# Altium project Control de Carga IoT.PrjPcb
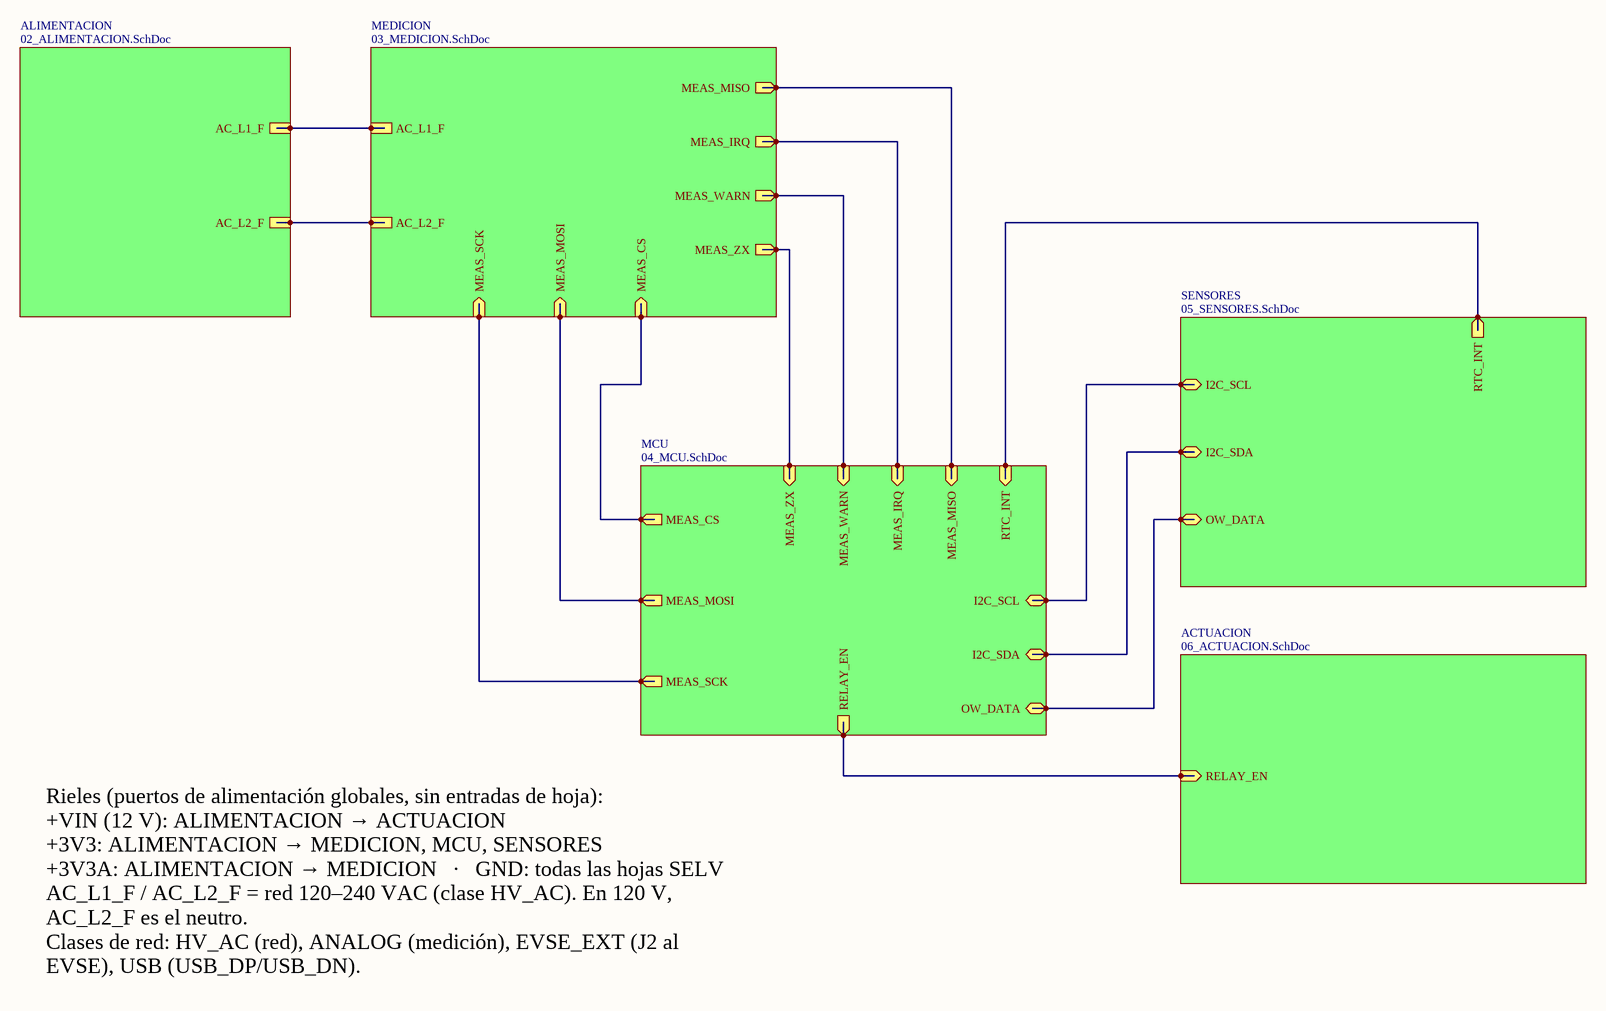
[diagram p0: 01_TOP.SchDoc]
DrawnBy: Nicolás Gómez Ramírez; ProjectName: Control de carga EVSE; Revision: 1.0
6 sheets, 132 parts. Net scope: hierarchical (ports join the sheet entries above them; power ports are global).
Board file: EVSE_Monitor.PcbDoc
Sheets:
  01_TOP.SchDoc
    ALIMENTACION = 02_ALIMENTACION.SchDoc
    MEDICION = 03_MEDICION.SchDoc
    MCU = 04_MCU.SchDoc
    SENSORES = 05_SENSORES.SchDoc
    ACTUACION = 06_ACTUACION.SchDoc

## Sheet 01_TOP.SchDoc: Diagrama de bloques (hoja TOP)
size 420 x 297 mm; Address1: Hardware en IoT · 2026; SheetNumber: 1; SheetTotal: 6

### Sub-sheets
ACTUACION = 06_ACTUACION.SchDoc: RELAY_EN (in)
ALIMENTACION = 02_ALIMENTACION.SchDoc: AC_L1_F, AC_L2_F
MCU = 04_MCU.SchDoc: MEAS_MISO (in), MEAS_IRQ (in), I2C_SDA (bidir), I2C_SCL (bidir), MEAS_SCK (out), MEAS_MOSI (out), MEAS_CS (out), RELAY_EN (out), MEAS_WARN (in), MEAS_ZX (in), RTC_INT (in), OW_DATA (bidir)
MEDICION = 03_MEDICION.SchDoc: AC_L1_F, AC_L2_F, MEAS_IRQ (out), MEAS_WARN (out), MEAS_MISO (out), MEAS_ZX (out), MEAS_SCK (in), MEAS_MOSI (in), MEAS_CS (in)
SENSORES = 05_SENSORES.SchDoc: I2C_SCL (bidir), I2C_SDA (bidir), OW_DATA (bidir), RTC_INT (out)

### Nets
AC_L1_F: sheet ALIMENTACION/AC_L1_F, sheet MEDICION/AC_L1_F
AC_L2_F: sheet ALIMENTACION/AC_L2_F, sheet MEDICION/AC_L2_F
I2C_SCL: sheet MCU/I2C_SCL, sheet SENSORES/I2C_SCL
I2C_SDA: sheet MCU/I2C_SDA, sheet SENSORES/I2C_SDA
MEAS_CS: sheet MEDICION/MEAS_CS, sheet MCU/MEAS_CS
MEAS_IRQ: sheet MEDICION/MEAS_IRQ, sheet MCU/MEAS_IRQ
MEAS_MISO: sheet MEDICION/MEAS_MISO, sheet MCU/MEAS_MISO
MEAS_MOSI: sheet MEDICION/MEAS_MOSI, sheet MCU/MEAS_MOSI
MEAS_SCK: sheet MEDICION/MEAS_SCK, sheet MCU/MEAS_SCK
MEAS_WARN: sheet MEDICION/MEAS_WARN, sheet MCU/MEAS_WARN
MEAS_ZX: sheet MEDICION/MEAS_ZX, sheet MCU/MEAS_ZX
OW_DATA: sheet MCU/OW_DATA, sheet SENSORES/OW_DATA
RELAY_EN: sheet MCU/RELAY_EN, sheet ACTUACION/RELAY_EN
RTC_INT: sheet MCU/RTC_INT, sheet SENSORES/RTC_INT

### Notes on the sheet
- Rieles (puertos de alimentación globales, sin entradas de hoja):
  +VIN (12 V): ALIMENTACION → ACTUACION
  +3V3: ALIMENTACION → MEDICION, MCU, SENSORES
  +3V3A: ALIMENTACION → MEDICION   ·   GND: todas las hojas SELV
  AC_L1_F / AC_L2_F = red 120–240 VAC (clase HV_AC). En 120 V, AC_L2_F es el neutro.
  Clases de red: HV_AC (red), ANALOG (medición), EVSE_EXT (J2 al EVSE), USB (USB_DP/USB_DN).
- CONTROL DE CARGA EVSE · HARDWARE EN IOT 2026
- DISEÑO: NICOLÁS GÓMEZ RAMÍREZ
- DWG NO:
- REVISION
- REV:
- DESCRIPTION
- DATE
- APPROVED
- ZONA DE RED 120–240 VAC CON AISLAMIENTO REFORZADO
- USO ACADÉMICO, SIN GARANTÍA.
- ENG:
- APPROVALS
- PROJECT
- DSN:
- CHK:
- REFERENCE DOCUMENTS
- PROJECT REVISION:
- TITLE
- DOCUMENT REVISION:
- DESIGN BY:
- BOM:
- FAB DWG:
- PCB DWG:
- ASSY DWG:
- SCALE:
- A3
- SIZE
- CAGE CODE
- FILE NAME
- DWG NO.
- SHEET
- OF
- REV

## Sheet 02_ALIMENTACION.SchDoc: Alimentación: red, 12 V y 3,3 V
size 420 x 297 mm; Address1: Hardware en IoT · 2026; SheetNumber: 2; SheetTotal: 6
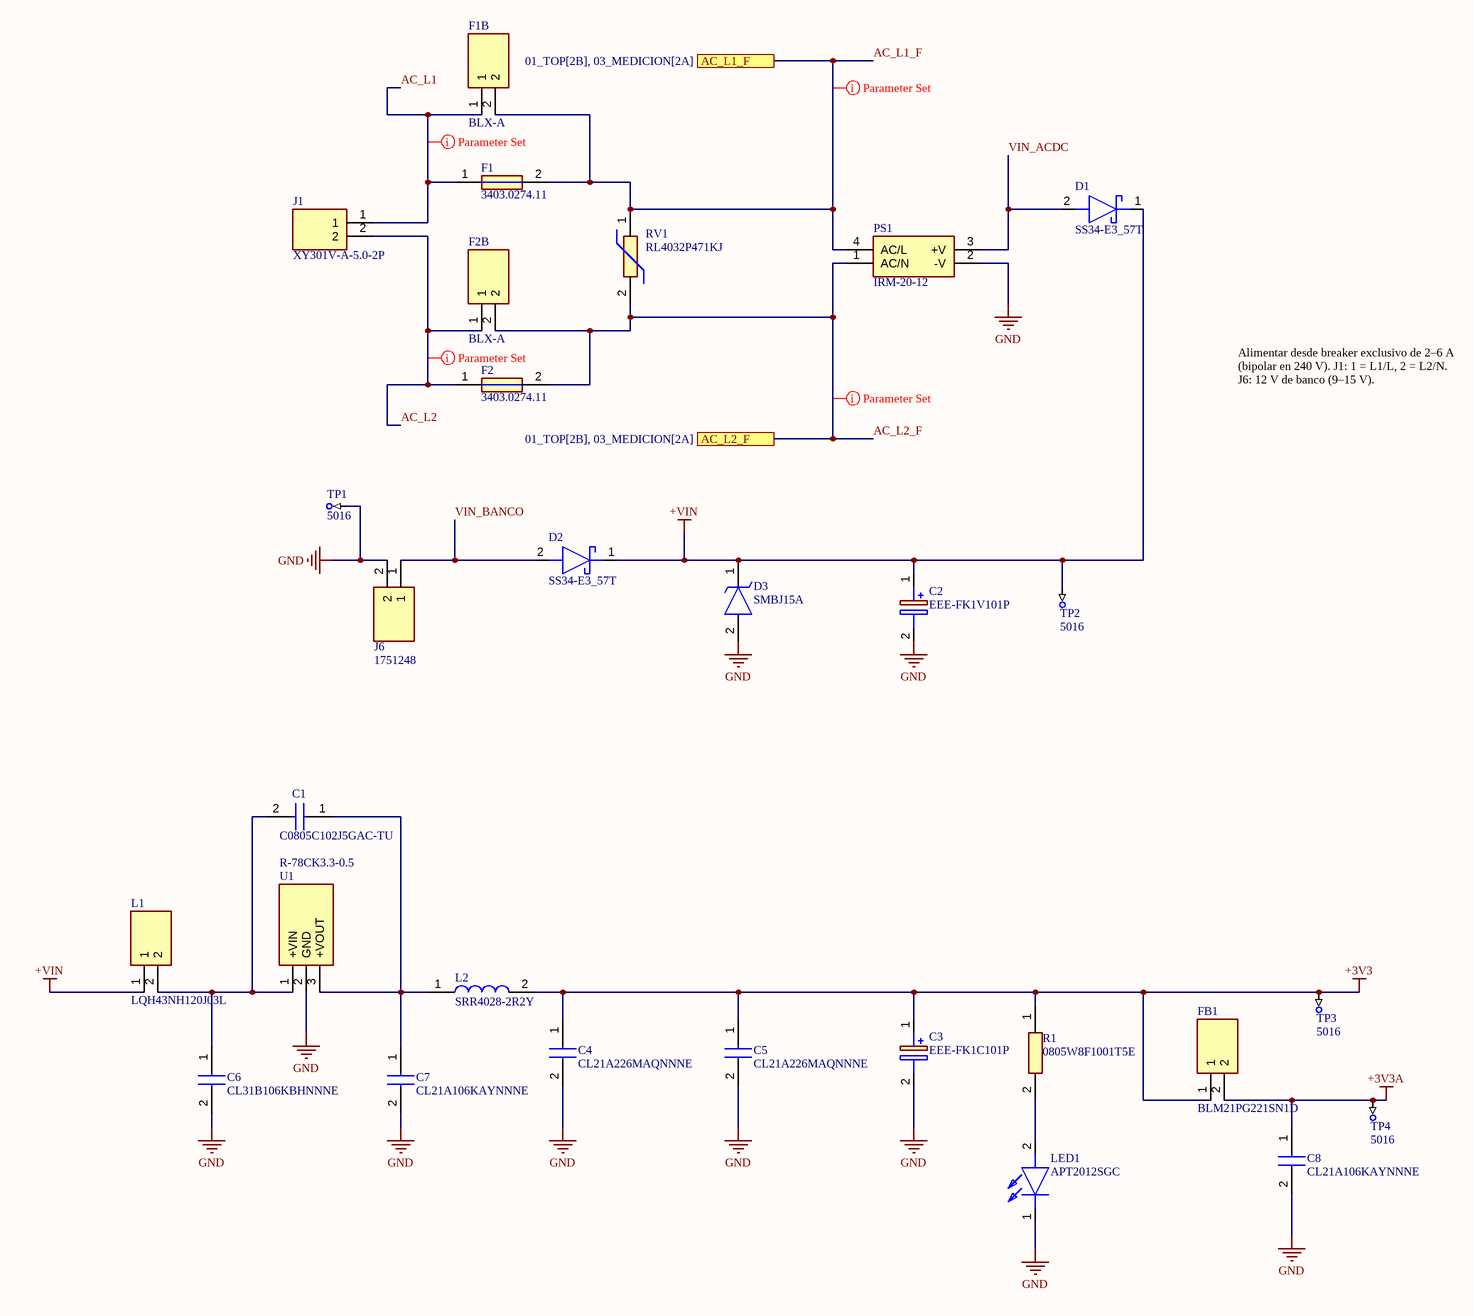
[diagram p1: 02_ALIMENTACION.SchDoc]

### Parts
C1  C0805C102J5GAC-TU  [CAPC2012X88N]
C2  EEE-FK1V101P  [EEHZT1E331UP]
C3  EEE-FK1C101P  [EEE1AA101SP]
C4  CL21A226MAQNNNE  [CAPC2012X140N]
C5  CL21A226MAQNNNE  [CAPC2012X140N]
C6  CL31B106KBHNNNE  [CAPC3216X180N]
C7  CL21A106KAYNNNE  [CAPC2012X145N]
C8  CL21A106KAYNNNE  [CAPC2012X145N]
D1  SS34-E3_57T  [DIOM7959X262N]
D2  SS34-E3_57T  [DIOM7959X262N]
D3  SMBJ15A  [DIOM5436X244N]
F1  3403.0274.11  [3403027423]
F1B  BLX-A  [BLX-A_5X20]
F2  3403.0274.11  [3403027423]
F2B  BLX-A  [BLX-A_5X20]
FB1  BLM21PG221SN1D  [BEADC2012X105N]
J1  XY301V-A-5.0-2P  [TB001-500-02BE]
J6  1751248  [1751248]
L1  LQH43NH120J03L  [RLS126]
L2  SRR4028-2R2Y  [SRR4028]
LED1  APT2012SGC  [LEDC2012X85N]
PS1  IRM-20-12  [IRM2012]
R1  0805W8F1001T5E  [RESC2012X60N]
RV1  RL4032P471KJ  [CU4032]
TP1  5016  [KEYSTONE-5016_V]
TP2  5016  [KEYSTONE-5016_V]
TP3  5016  [KEYSTONE-5016_V]
TP4  5016  [KEYSTONE-5016_V]
U1  R-78CK3.3-0.5  [R78CK3305]

### Ports
AC_L1_F (see 01_TOP[2B], 03_MEDICION[2A]), AC_L2_F (see 01_TOP[2B], 03_MEDICION[2A])

### Nets
+3V3: C3.1(+) C4.1 C5.1 FB1.1 L2.2 R1.1 TP3.1
+3V3A: C8.1 FB1.2 TP4.1
+VIN: C2.1(+) D1.1(K) D2.1(K) D3.1(K) L1.1 TP2.1
GND: C2.2(-) C3.2(-) C4.2 C5.2 C6.2 C7.2 C8.2 D3.2(A) J6.2 LED1.1(K) PS1.2(-V) TP1.1 U1.2(GND)
AC_L1: F1.1 F1B.1 J1.1
AC_L1_F: F1.2 F1B.2 PS1.4(AC/L) RV1.1 ; port AC_L1_F
AC_L2: F2.1 F2B.1 J1.2
AC_L2_F: F2.2 F2B.2 PS1.1(AC/N) RV1.2 ; port AC_L2_F
VIN_ACDC: D1.2(A) PS1.3(+V)
VIN_BANCO: D2.2(A) J6.1
NetC1_1: C1.1 C7.1 L2.1 U1.3(+VOUT)
NetC1_2: C1.2 C6.1 L1.2 U1.1(+VIN)
NetLED1_2: LED1.2(A) R1.2

### Layout directives
net class HV_AC: AC_L1, AC_L1_F, AC_L2, AC_L2_F

### Notes on the sheet
- Alimentar desde breaker exclusivo de 2–6 A (bipolar en 240 V). J1: 1 = L1/L, 2 = L2/N. J6: 12 V de banco (9–15 V).
- CONTROL DE CARGA EVSE · HARDWARE EN IOT 2026
- DISEÑO: NICOLÁS GÓMEZ RAMÍREZ
- DWG NO:
- REVISION
- REV:
- DESCRIPTION
- DATE
- APPROVED
- ZONA DE RED 120–240 VAC CON AISLAMIENTO REFORZADO
- USO ACADÉMICO, SIN GARANTÍA.
- ENG:
- APPROVALS
- PROJECT
- DSN:
- CHK:
- REFERENCE DOCUMENTS
- PROJECT REVISION:
- TITLE
- DOCUMENT REVISION:
- DESIGN BY:
- BOM:
- FAB DWG:
- PCB DWG:
- ASSY DWG:
- SCALE:
- A3
- SIZE
- CAGE CODE
- FILE NAME
- DWG NO.
- SHEET
- OF
- REV

### Library data of the parts
C1 = C0805C102J5GAC-TU: Capacitor; Manufacturer_Name: KEMET; Manufacturer_Part_Number: C0805C102J5GACTU; Assembly: JLCPCB; Value: 1nF 50V C0G; Datasheet Link: https://www.kemet.com/specsheet/C0805C102J5GACTU; Height: 0.88mm; Supplier: JLCPCB; Supplier PN: LCSC C2167084
C2 = EEE-FK1V101P: Capacitor Polarised; Manufacturer_Name: Panasonic; Assembly: JLCPCB; Value: 100uF 35V; Datasheet Link: http://industrial.panasonic.com/cdbs/www-data/pdf/RDE0000/ABA0000C1181.pdf; Height: 10.8mm; Manufacturer_Part_Number: EEE-FK1V101P; Supplier: JLCPCB; Supplier PN: LCSC C128462
C3 = EEE-FK1C101P: Capacitor Polarised; Manufacturer_Name: Panasonic; Assembly: JLCPCB; Value: 100uF 16V; Datasheet Link: http://industrial.panasonic.com/cdbs/www-data/pdf/RDE0000/ABA0000C1181.pdf; Height: 7.8mm; Manufacturer_Part_Number: EEE-FK1C101P; Supplier: JLCPCB; Supplier PN: LCSC C128532
C4 C5 = CL21A226MAQNNNE: Capacitor; Manufacturer_Name: Samsung Electro-Mechanics; Assembly: JLCPCB; Value: 22uF 25V; Datasheet Link: https://datasheet.datasheetarchive.com/originals/distributors/Datasheets-DGA10/2406310.pdf; Height: 1.4mm; Manufacturer_Part_Number: CL21A226MAQNNNE; Supplier: JLCPCB; Supplier PN: LCSC C45783
C6 = CL31B106KBHNNNE: Capacitor; Manufacturer_Name: Samsung Electro-Mechanics; Assembly: JLCPCB; Value: 10uF 50V; Datasheet Link: https://datasheet.datasheetarchive.com/originals/distributors/DKDS-19/375194.pdf; Height: 1.8mm; Manufacturer_Part_Number: CL31B106KBHNNNE; Supplier: JLCPCB; Supplier PN: LCSC C89632
C7 C8 = CL21A106KAYNNNE: Capacitor; Manufacturer_Name: Samsung Electro-Mechanics; Assembly: JLCPCB; Value: 10uF 25V; Datasheet Link: https://datasheet.datasheetarchive.com/originals/distributors/Datasheets_SAMA/6a45835c9b7400e9b49c55c38a8ff4a2.pdf; Height: 1.45mm; Manufacturer_Part_Number: CL21A106KAYNNNE; Supplier: JLCPCB; Supplier PN: LCSC C15850
D1 D2 = SS34-E3_57T: Schottky Diode; Manufacturer_Name: Vishay; Manufacturer_Part_Number: SS34-E3/57T; Assembly: JLCPCB; Value: 40V 3A; Datasheet Link: https://www.vishay.com/docs/88751/ss32.pdf; Height: 2.62mm; Supplier: JLCPCB; Supplier PN: LCSC C13354
D3 = SMBJ15A: TVS Diode (Uni-directional); Manufacturer_Name: Littelfuse; Assembly: JLCPCB; Value: 15V 600W; Datasheet Link: http://www.vishay.com/docs/88392/smbj.pdf; Height: 2.44mm; Manufacturer_Part_Number: SMBJ15A; Supplier: JLCPCB; Supplier PN: LCSC C83846
F1 F2 = 3403.0274.11: Fusible SMD UMT-H T1A 277 VAC, ruptura 1500 A (bolsa); Manufacturer_Name: Schurter; Assembly: JLCPCB; Manufacturer_Part_Number: 3403.0274.11; Supplier: JLCPCB; Supplier PN: LCSC C6384960; Value: T1A 277VAC
F1B F2B = BLX-A: Portafusible 5x20 mm para PCB, 2 pines a 22 mm (XC Electronics BLX-A, LCSC C3131); Assembly: DNP; Value: 5x20 6.3A 250V; Manufacturer_Name: XC Electronics; Manufacturer_Part_Number: BLX-A; Supplier: Sigma; Supplier PN: BLX-A
FB1 = BLM21PG221SN1D: Ferrite Bead; Manufacturer_Name: Murata; Assembly: JLCPCB; Value: 220R@100MHz; Datasheet Link: https://datasheet.datasheetarchive.com/originals/dk/DKDS-31/605570.pdf; Height: 1.05mm; Manufacturer_Part_Number: BLM21PG221SN1D; Supplier: JLCPCB; Supplier PN: LCSC C85840
J1 = XY301V-A-5.0-2P: Bornera de tornillo 2 polos, paso 5.0 mm, 300 V 15 A, 22-14 AWG; Manufacturer_Name: Xinlaiya; Assembly: JLCPCB; Value: 2P 5.0mm 300V; Manufacturer_Part_Number: XY301V-A-5.0-2P; Supplier: JLCPCB; Supplier PN: LCSC C557651
J6 = 1751248: Connector; Manufacturer_Name: Phoenix Contact; Assembly: JLCPCB; Value: 2P 3.5mm; Datasheet Link: https://www.phoenixcontact.com/en-us/products/printed-circuit-board-terminal-mkds-1-2-35-1751248?type=pdf; Height: 8.65mm; Manufacturer_Part_Number: 1751248; Supplier: JLCPCB; Supplier PN: LCSC C89122
L1 = LQH43NH120J03L: Inductor 12 uH 5% 420 mA 0.25 ohm 1812, AEC-Q200; Manufacturer_Name: Murata; Assembly: JLCPCB; Value: 12uH; Manufacturer_Part_Number: LQH43NH120J03L; Supplier: JLCPCB; Supplier PN: LCSC C3224514
L2 = SRR4028-2R2Y: Inductor; Manufacturer_Name: Bourns; Assembly: JLCPCB; Value: 2.2uH; Datasheet Link: https://www.bourns.com/pdfs/SRR4028.pdf; Manufacturer_Part_Number: SRR4028-2R2Y; Supplier: JLCPCB; Supplier PN: LCSC C2041777
LED1 = APT2012SGC: LED; Manufacturer_Name: Kingbright; Assembly: JLCPCB; Value: verde; Datasheet Link: http://www.us.kingbright.com/images/catalog/SPEC/APT2012SGC.pdf; Height: 0.85mm; Manufacturer_Part_Number: APT2012SGC; Supplier: JLCPCB; Supplier PN: LCSC C5353439
PS1 = IRM-20-12: Power Supply; Manufacturer_Name: Mean Well; Assembly: JLCPCB; Value: 12V 1.8A; Datasheet Link: https://www.meanwell.com/Upload/PDF/IRM-20/IRM-20-SPEC.PDF; Height: 24mm; Manufacturer_Part_Number: IRM-20-12; Supplier: JLCPCB; Supplier PN: LCSC C5278499
R1 = 0805W8F1001T5E: Resistor 1 kOhm 1% 125 mW 0805; Manufacturer_Name: UNI-ROYAL; Assembly: JLCPCB; Value: 1k; Manufacturer_Part_Number: 0805W8F1001T5E; Supplier: JLCPCB; Supplier PN: LCSC C17513
RV1 = RL4032P471KJ: Varistor SMD 300 VAC, 470 V, 2500 A (8/20 us), 30 J, 4032; Manufacturer_Name: Ruilon; Assembly: JLCPCB; Value: 300VAC; Manufacturer_Part_Number: RL4032P471KJ; Supplier: JLCPCB; Supplier PN: LCSC C2935514
TP1-TP4 = CMP-2000-05178-1: Test Point, 1-Pin SMT, RoHS, Tape and Reel; Manufacturer: Keystone; Manufacturer_Name: ronghe; Manufacturer_Part_Number: RH-5016; Other Names: 5016KDKR; Featured Product: SurfaceMountTestPoints / 5019MiniatureSurfaceMountTestPoint; Online Catalog: SurfaceMountTestPoints; Catalog Drawings: 5016Top / 5016Side / 5016Front; Value: TP; Assembly: JLCPCB; Packaging: Digi-Reel; RoHS Information: RoHSComplianceStatement; Package Reference: 5016; Mounting Type: SurfaceMount; Type: PCTestPoint,Compact; Manufacturer URL: http://www.keyelco.com/; Standard Package: 1; Package Description: 1-Pin Test Point, Body 3.81 x 2.04 mm; Category: TestandMeasurement; Terminal: 0.015"(0.38mm)PhosphorBronze,SilverPlated; Datasheet URL: https://ciiva.com/datasheet-click-2917613?src=ciiva&sig=4a4e90f; Datasheet Version: Rev. D, 03/2014; Family: TestPoints; Material: PhosphorBronze; Supplier: JLCPCB; Supplier PN: LCSC C5199799
U1 = R-78CK3.3-0.5: Regulador conmutado 3.3 V 0.5 A, SIP3; Manufacturer_Name: RECOM Power; Assembly: Manual; Datasheet Link: https://recom-power.com/pdf/Innoline/R-78CK-0.5.pdf; Height: 10.7mm; Manufacturer_Part_Number: R-78CK3.3-0.5; Supplier: Disponible; Supplier PN: -; Value: 3.3V 0.5A

## Sheet 03_MEDICION.SchDoc: Medición de tensión y corriente
size 420 x 297 mm; Address1: Hardware en IoT · 2026; SheetNumber: 3; SheetTotal: 6
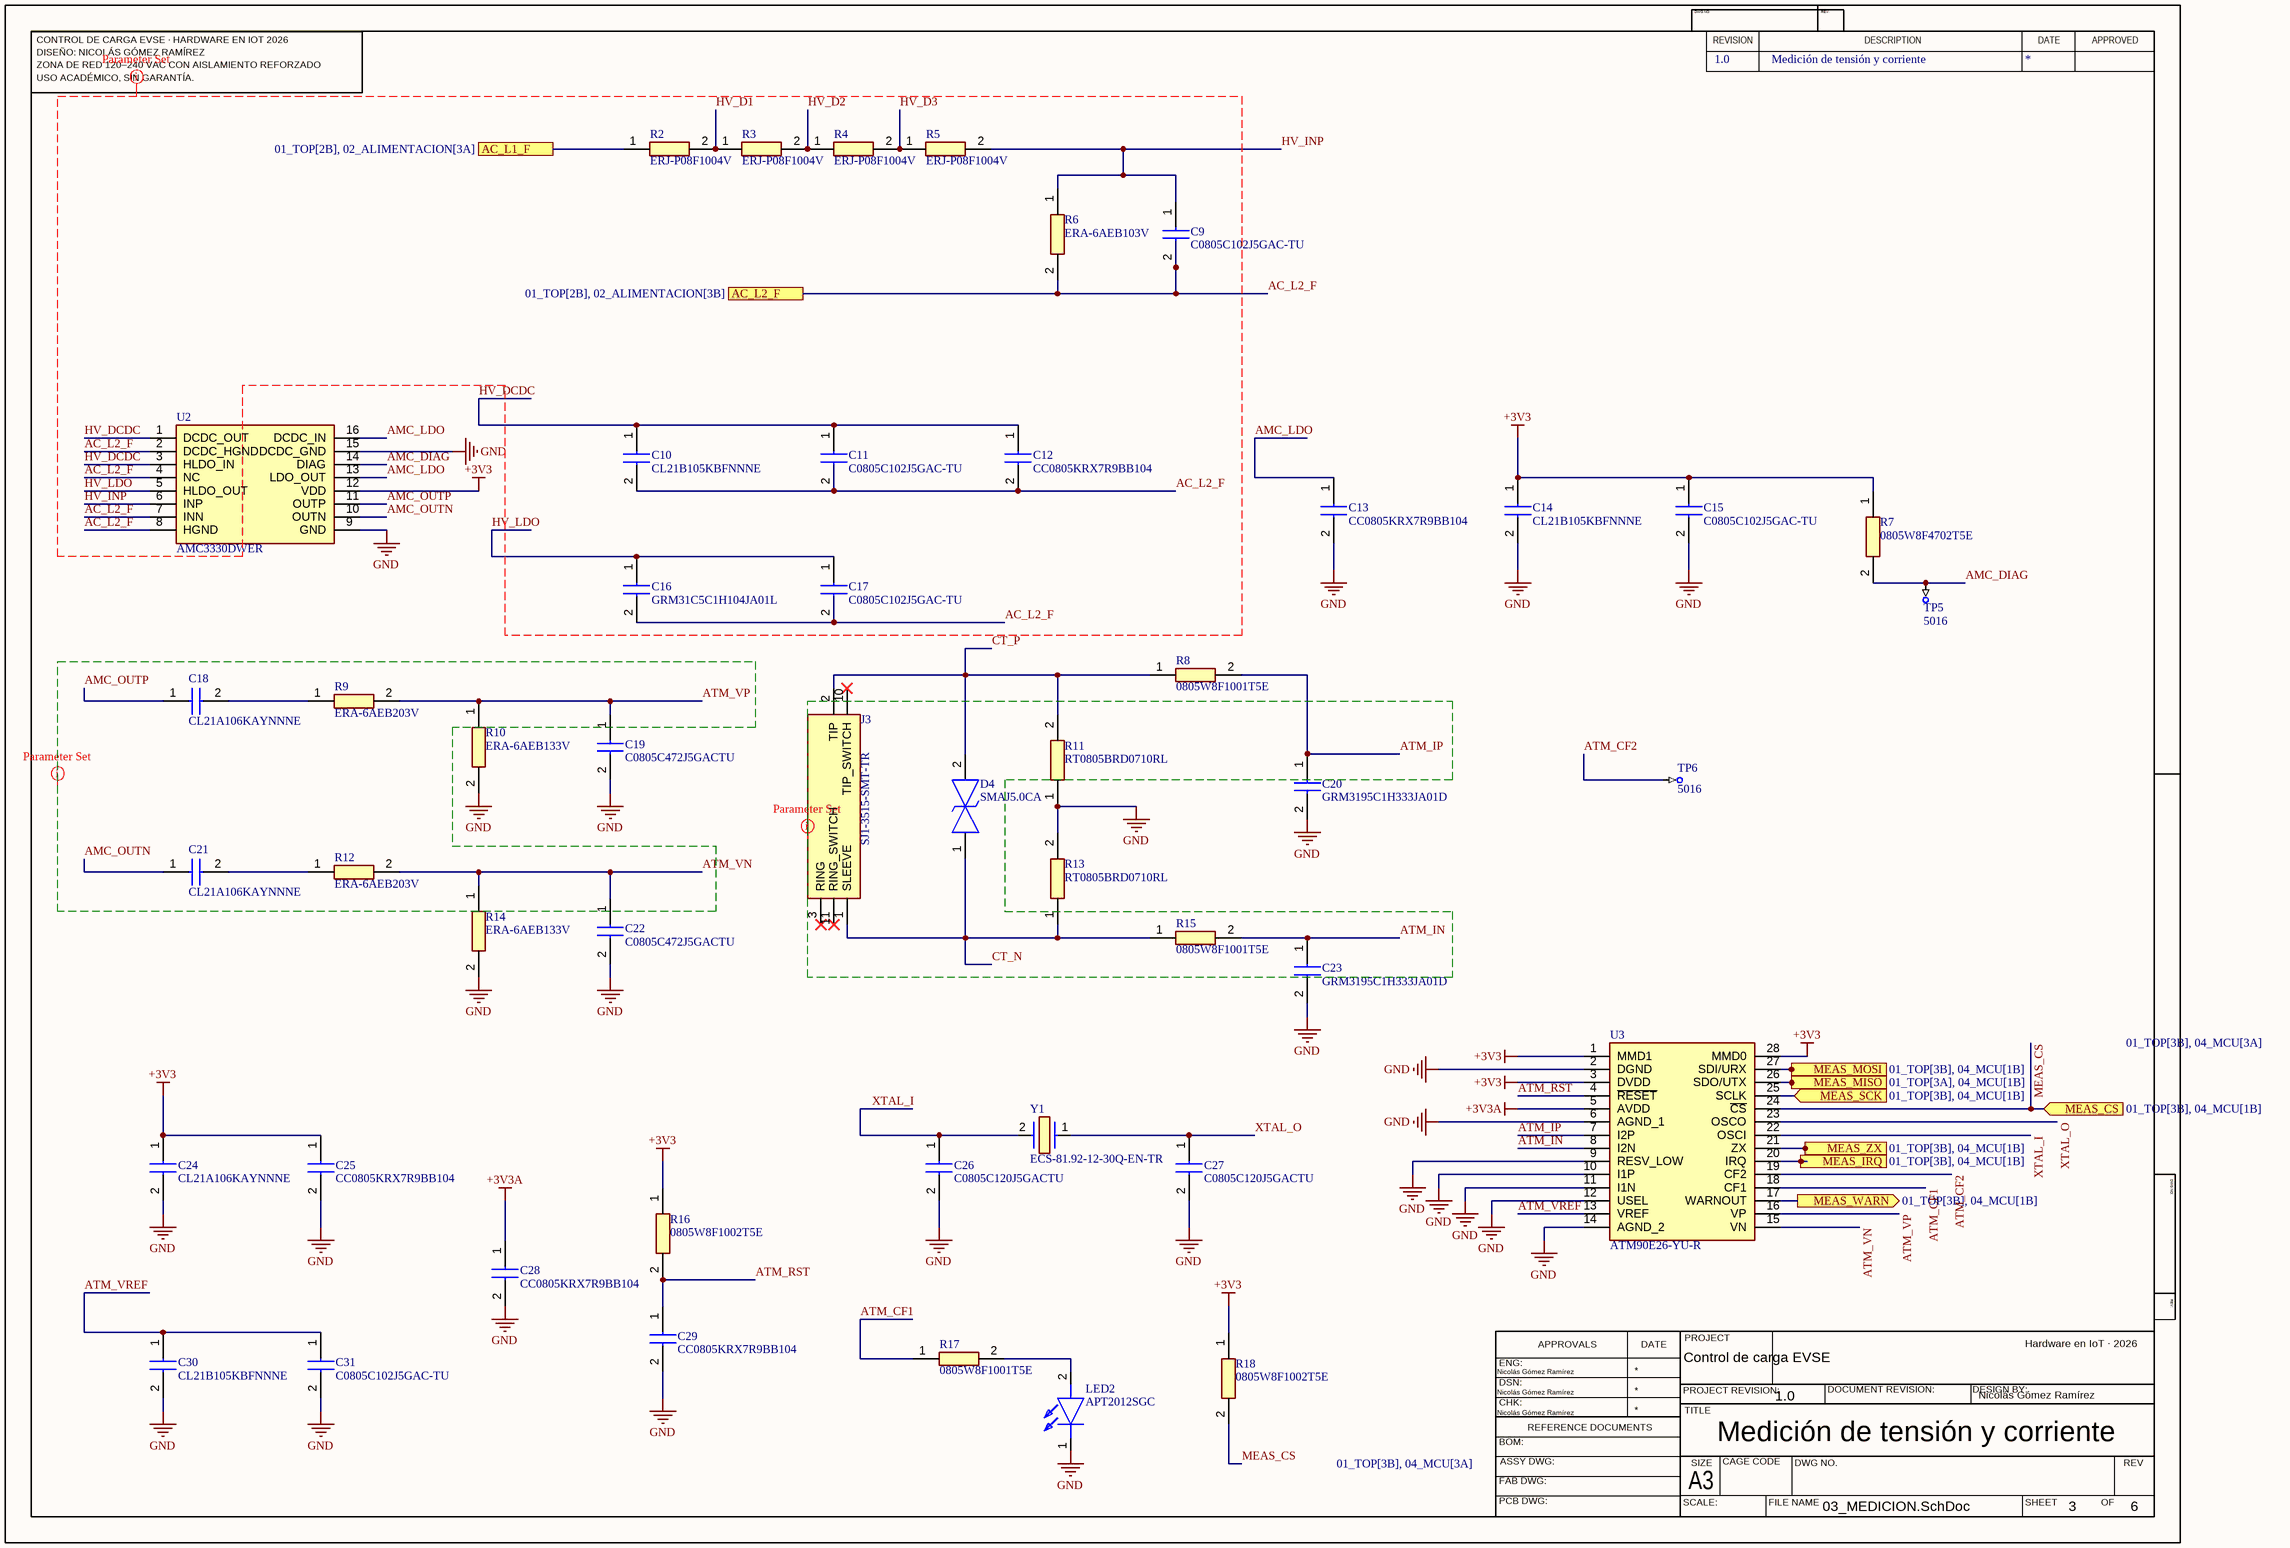
[diagram p2: 03_MEDICION.SchDoc]

### Parts
C9  C0805C102J5GAC-TU  [CAPC2012X88N]
C10  CL21B105KBFNNNE  [CAPC2012X88N]
C11  C0805C102J5GAC-TU  [CAPC2012X88N]
C12  CC0805KRX7R9BB104  [CAPC2012X88N]
C13  CC0805KRX7R9BB104  [CAPC2012X88N]
C14  CL21B105KBFNNNE  [CAPC2012X88N]
C15  C0805C102J5GAC-TU  [CAPC2012X88N]
C16  GRM31C5C1H104JA01L  [CAPC3216X180N]
C17  C0805C102J5GAC-TU  [CAPC2012X88N]
C18  CL21A106KAYNNNE  [CAPC2012X145N]
C19  C0805C472J5GACTU  [CAPC2012X88N]
C20  GRM3195C1H333JA01D  [CAPC3216X180N]
C21  CL21A106KAYNNNE  [CAPC2012X145N]
C22  C0805C472J5GACTU  [CAPC2012X88N]
C23  GRM3195C1H333JA01D  [CAPC3216X180N]
C24  CL21A106KAYNNNE  [CAPC2012X145N]
C25  CC0805KRX7R9BB104  [CAPC2012X88N]
C26  C0805C120J5GACTU  [CAPC2012X88N]
C27  C0805C120J5GACTU  [CAPC2012X88N]
C28  CC0805KRX7R9BB104  [CAPC2012X88N]
C29  CC0805KRX7R9BB104  [CAPC2012X88N]
C30  CL21B105KBFNNNE  [CAPC2012X88N]
C31  C0805C102J5GAC-TU  [CAPC2012X88N]
D4  SMAJ5.0CA  [DIONM5026X229N]
J3  SJ1-3515-SMT-TR  [SJ13515SMTTR]
LED2  APT2012SGC  [LEDC2012X85N]
R2  ERJ-P08F1004V  [ERJP08_(1206)]
R3  ERJ-P08F1004V  [ERJP08_(1206)]
R4  ERJ-P08F1004V  [ERJP08_(1206)]
R5  ERJ-P08F1004V  [ERJP08_(1206)]
R6  ERA-6AEB103V  [RESC2012X60N]
R7  0805W8F4702T5E  [RESC2012X60N]
R8  0805W8F1001T5E  [RESC2012X60N]
R9  ERA-6AEB203V  [RESC2012X60N]
R10  ERA-6AEB133V  [RESC2012X60N]
R11  RT0805BRD0710RL  [RESC2012X60N]
R12  ERA-6AEB203V  [RESC2012X60N]
R13  RT0805BRD0710RL  [RESC2012X60N]
R14  ERA-6AEB133V  [RESC2012X60N]
R15  0805W8F1001T5E  [RESC2012X60N]
R16  0805W8F1002T5E  [RESC2012X60N]
R17  0805W8F1001T5E  [RESC2012X60N]
R18  0805W8F1002T5E  [RESC2012X60N]
TP5  5016  [KEYSTONE-5016_V]
TP6  5016  [KEYSTONE-5016_V]
U2  AMC3330DWER  [SOIC127P1030X265-16N]
U3  ATM90E26-YU-R  [SOP65P778X199-28N]
Y1  ECS-81.92-12-30Q-EN-TR  [ECS81921230QENTR]

### Ports
AC_L1_F (see 01_TOP[2B], 02_ALIMENTACION[3A]), AC_L2_F (see 01_TOP[2B], 02_ALIMENTACION[3B]), MEAS_CS (in, see 01_TOP[3B], 04_MCU[1B]), MEAS_IRQ (out, see 01_TOP[3B], 04_MCU[1B]), MEAS_MISO (out, see 01_TOP[3A], 04_MCU[1B]), MEAS_MOSI (in, see 01_TOP[3B], 04_MCU[1B]), MEAS_SCK (in, see 01_TOP[3B], 04_MCU[1B]), MEAS_WARN (out, see 01_TOP[3B], 04_MCU[1B]), MEAS_ZX (out, see 01_TOP[3B], 04_MCU[1B])

### Nets
+3V3: C14.1 C15.1 C24.1 C25.1 R7.1 R16.1 R18.1 U2.12(VDD) U3.1(MMD1) U3.3(DVDD) U3.28(MMD0)
+3V3A: C28.1 U3.5(AVDD)
GND: C13.2 C14.2 C15.2 C19.2 C20.2 C22.2 C23.2 C24.2 C25.2 C26.2 C27.2 C28.2 C29.2 C30.2 C31.2 LED2.1(K) R10.2 R11.1 R13.2 R14.2 U2.9(GND) U2.15(DCDC_GND) U3.2(DGND) U3.6(AGND_1) U3.9(RESV_LOW) U3.10(I1P) U3.11(I1N) U3.12(USEL) U3.14(AGND_2)
AC_L1_F: R2.1 ; port AC_L1_F
AC_L2_F: C9.2 C10.2 C11.2 C12.2 C16.2 C17.2 R6.2 U2.2(DCDC_HGND) U2.4(NC) U2.7(INN) U2.8(HGND) ; port AC_L2_F
AMC_DIAG: R7.2 TP5.1 U2.14(DIAG)
AMC_LDO: C13.1 U2.13(LDO_OUT) U2.16(DCDC_IN)
AMC_OUTN: C21.1 U2.10(OUTN)
AMC_OUTP: C18.1 U2.11(OUTP)
ATM_CF1: R17.1 U3.18(CF1)
ATM_CF2: TP6.1 U3.19(CF2)
ATM_IN: C23.1 R15.2 U3.8(I2N)
ATM_IP: C20.1 R8.2 U3.7(I2P)
ATM_RST: C29.1 R16.2 U3.4(~{RESET})
ATM_VN: C22.1 R12.2 R14.1 U3.15(VN)
ATM_VP: C19.1 R9.2 R10.1 U3.16(VP)
ATM_VREF: C30.1 C31.1 U3.13(VREF)
CT_N: D4.1 J3.1(SLEEVE) R13.1 R15.1
CT_P: D4.2 J3.2(TIP) R8.1 R11.2
HV_D1: R2.2 R3.1
HV_D2: R3.2 R4.1
HV_D3: R4.2 R5.1
HV_DCDC: C10.1 C11.1 C12.1 U2.1(DCDC_OUT) U2.3(HLDO_IN)
HV_INP: C9.1 R5.2 R6.1 U2.6(INP)
HV_LDO: C16.1 C17.1 U2.5(HLDO_OUT)
MEAS_CS: R18.2 U3.24(~{CS}) ; port MEAS_CS
MEAS_IRQ: U3.20(IRQ) ; port MEAS_IRQ
MEAS_MISO: U3.26(SDO/UTX) ; port MEAS_MISO
MEAS_MOSI: U3.27(SDI/URX) ; port MEAS_MOSI
MEAS_SCK: U3.25(SCLK) ; port MEAS_SCK
MEAS_WARN: U3.17(WARNOUT) ; port MEAS_WARN
MEAS_ZX: U3.21(ZX) ; port MEAS_ZX
XTAL_I: C26.1 U3.22(OSCI) Y1.2(OUT/IN)
XTAL_O: C27.1 U3.23(OSCO) Y1.1(IN/OUT)
NetC18_2: C18.2 R9.1
NetC21_2: C21.2 R12.1
NetLED2_2: LED2.2(A) R17.2

Not connected (* = marked no-connect by the designer): J3 3(RING)* 10(TIP_SWITCH)* 11(RING_SWITCH)*

### Layout directives
net class HV_AC: AC_L2_F, HV_D1, HV_D2, HV_D3, HV_DCDC, HV_INP, HV_LDO
net class ANALOG: AMC_OUTN, AMC_OUTP, ATM_IN, ATM_IP, ATM_VN, ATM_VP, CT_N

### Notes on the sheet
- CONTROL DE CARGA EVSE · HARDWARE EN IOT 2026
- DISEÑO: NICOLÁS GÓMEZ RAMÍREZ
- DWG NO:
- REVISION
- REV:
- DESCRIPTION
- DATE
- APPROVED
- ZONA DE RED 120–240 VAC CON AISLAMIENTO REFORZADO
- USO ACADÉMICO, SIN GARANTÍA.
- ENG:
- APPROVALS
- PROJECT
- DSN:
- CHK:
- REFERENCE DOCUMENTS
- PROJECT REVISION:
- TITLE
- DOCUMENT REVISION:
- DESIGN BY:
- BOM:
- FAB DWG:
- PCB DWG:
- ASSY DWG:
- SCALE:
- A3
- SIZE
- CAGE CODE
- FILE NAME
- DWG NO.
- SHEET
- OF
- REV

### Library data of the parts
C9 C11 C15 C17 C31 = C0805C102J5GAC-TU: as C1 on sheet 02_ALIMENTACION; Datasheet Link: https://www.kemet.com/specsheet/C0805C102J5GACTU; Height: 0.88mm; Supplier: JLCPCB; Supplier PN: LCSC C2167084
C10 C14 C30 = CL21B105KBFNNNE: Capacitor 1 uF 50 V X7R 10% 0805; Manufacturer_Name: Samsung Electro-Mechanics; Assembly: JLCPCB; Manufacturer_Part_Number: CL21B105KBFNNNE; Supplier: JLCPCB; Supplier PN: LCSC C28323; Value: 1uF 50V X7R
C12 C13 C25 C28 C29 = CC0805KRX7R9BB104: Capacitor 100 nF 50 V X7R 10% 0805; Manufacturer_Name: YAGEO; Assembly: JLCPCB; Manufacturer_Part_Number: CC0805KRX7R9BB104; Supplier: JLCPCB; Supplier PN: LCSC C49678; Value: 100nF 50V X7R
C16 = GRM31C5C1H104JA01L: Capacitor ceramico 100 nF 50 V C0G 5% 1206; Manufacturer_Name: Murata; Assembly: JLCPCB; Manufacturer_Part_Number: GRM31C5C1H104JA01L; Supplier: JLCPCB; Supplier PN: LCSC C97946; Value: 100nF 50V C0G
C18 C21 C24 = CL21A106KAYNNNE: as C7 on sheet 02_ALIMENTACION; Datasheet Link: https://datasheet.datasheetarchive.com/originals/distributors/Datasheets_SAMA/6a45835c9b7400e9b49c55c38a8ff4a2.pdf; Height: 1.45mm; Manufacturer_Part_Number: CL21A106KAYNNNE; Supplier: JLCPCB; Supplier PN: LCSC C15850
C19 C22 = C0805C472J5GACTU: Capacitor; Manufacturer_Name: KEMET; Assembly: JLCPCB; Value: 4.7nF 50V C0G; Datasheet Link: https://www.kemet.com/specsheet/C0805C472J5GACTU; Height: 0.88mm; Manufacturer_Part_Number: C0805C472J5GACTU; Supplier: JLCPCB; Supplier PN: LCSC C2170898
C20 C23 = GRM3195C1H333JA01D: Capacitor ceramico 33 nF 50 V C0G 5% 1206; Manufacturer_Name: Murata; Assembly: JLCPCB; Manufacturer_Part_Number: GRM3195C1H333JA01D; Supplier: JLCPCB; Supplier PN: LCSC C97930; Value: 33nF 50V C0G
C26 C27 = C0805C120J5GACTU: Capacitor; Manufacturer_Name: KEMET; Assembly: JLCPCB; Value: 12pF 50V C0G; Datasheet Link: https://www.kemet.com/specsheet/C0805C120J5GACTU; Height: 0.88mm; Manufacturer_Part_Number: C0805C120J5GACTU; Supplier: JLCPCB; Supplier PN: LCSC C2168859
D4 = SMAJ5.0CA: TVS Diode (Bi-directional); Manufacturer_Name: Littelfuse; Assembly: JLCPCB; Value: 5V TVS bidir; Datasheet Link: http://www.littelfuse.com/~/media/electronics/datasheets/tvs_diodes/littelfuse_tvs_diode_smaj_datasheet.pdf.pdf; Height: 2.29mm; Manufacturer_Part_Number: SMAJ5.0CA; Supplier: JLCPCB; Supplier PN: LCSC C83324
J3 = SJ1-3515-SMT-TR: Connector; Manufacturer_Name: Same Sky; Assembly: JLCPCB; Value: jack 3.5mm; Datasheet Link: https://www.sameskydevices.com/product/resource/sj1-351x-smt.pdf; Height: 5.3mm; Manufacturer_Part_Number: SJ1-3515-SMT-TR; Supplier: JLCPCB; Supplier PN: LCSC C22359767
LED2 = APT2012SGC: as LED1 on sheet 02_ALIMENTACION; Datasheet Link: http://www.us.kingbright.com/images/catalog/SPEC/APT2012SGC.pdf; Height: 0.85mm; Manufacturer_Part_Number: APT2012SGC; Supplier: JLCPCB; Supplier PN: LCSC C5353439
R2-R5 = ERJ-P08F1004V: Resistor; Manufacturer_Name: Panasonic; Assembly: JLCPCB; Value: 1M 1206; Datasheet Link: http://industrial.panasonic.com/cdbs/www-data/pdf/RDO0000/AOA0000C331.pdf; Height: 0.7mm; Manufacturer_Part_Number: ERJ-P08F1004V; Supplier: JLCPCB; Supplier PN: LCSC C41369755
R6 = ERA-6AEB103V: Resistor; Manufacturer_Name: Panasonic; Value: 10k 0.1%; Assembly: JLCPCB; Height: 0.55mm; Manufacturer_Part_Number: ERA-6AEB103V; Supplier: JLCPCB; Supplier PN: LCSC C191101
R7 = 0805W8F4702T5E: Resistor 47 kOhm 1% 125 mW 0805; Manufacturer_Name: UNI-ROYAL; Value: 47k; Assembly: JLCPCB; Manufacturer_Part_Number: 0805W8F4702T5E; Supplier: JLCPCB; Supplier PN: LCSC C17713
R8 R15 R17 = 0805W8F1001T5E: as R1 on sheet 02_ALIMENTACION; Manufacturer_Part_Number: 0805W8F1001T5E; Supplier: JLCPCB; Supplier PN: LCSC C17513
R9 R12 = ERA-6AEB203V: Resistor; Manufacturer_Name: Panasonic; Value: 20k 0.1%; Assembly: JLCPCB; Height: 0.55mm; Manufacturer_Part_Number: ERA-6AEB203V; Supplier: JLCPCB; Supplier PN: LCSC C473304
R10 R14 = ERA-6AEB133V: Resistor; Manufacturer_Name: Panasonic; Value: 13k 0.1%; Assembly: JLCPCB; Height: 0.55mm; Manufacturer_Part_Number: ERA-6AEB133V; Supplier: JLCPCB; Supplier PN: LCSC C445658
R11 R13 = RT0805BRD0710RL: Resistencia de pelicula delgada 10 ohm 0.1% 25 ppm 0805; Manufacturer_Name: Yageo; Value: 10R 0.1%; Assembly: JLCPCB; Manufacturer_Part_Number: RT0805BRD0710RL; Supplier: JLCPCB; Supplier PN: LCSC C865142
R16 R18 = 0805W8F1002T5E: Resistor 10 kOhm 1% 125 mW 0805; Manufacturer_Name: UNI-ROYAL; Value: 10k; Assembly: JLCPCB; Manufacturer_Part_Number: 0805W8F1002T5E; Supplier: JLCPCB; Supplier PN: LCSC C17414
TP5 TP6 = CMP-2000-05178-1: as TP1 on sheet 02_ALIMENTACION; Packaging: Digi-Reel; RoHS Information: RoHSComplianceStatement; Package Reference: 5016; Mounting Type: SurfaceMount; Type: PCTestPoint,Compact; Manufacturer URL: http://www.keyelco.com/; Standard Package: 1; Package Description: 1-Pin Test Point, Body 3.81 x 2.04 mm; Category: TestandMeasurement; Terminal: 0.015"(0.38mm)PhosphorBronze,SilverPlated; Datasheet URL: https://ciiva.com/datasheet-click-2917613?src=ciiva&sig=4a4e90f; Datasheet Version: Rev. D, 03/2014; Family: TestPoints; Material: PhosphorBronze; Supplier: JLCPCB; Supplier PN: LCSC C5199799
U2 = AMC3330DWER: Amplificador aislado +-1 V con DC/DC integrado, aislamiento reforzado, SOIC-16 DWE (carrete); Manufacturer_Name: Texas Instruments; Assembly: JLCPCB; Value: ±1V iso amp; Manufacturer_Part_Number: AMC3330DWER; Supplier: JLCPCB; Supplier PN: LCSC C2999368
U3 = ATM90E26-YU-R: Integrated Circuit; Manufacturer_Name: Microchip; Assembly: JLCPCB; Value: energy meter; Datasheet Link: http://ww1.microchip.com/downloads/en/DeviceDoc/Atmel-46002-SE-M90E26-Datasheet.pdf; Height: 1.99mm; Manufacturer_Part_Number: ATM90E26-YU-R; Supplier: JLCPCB; Supplier PN: LCSC C616398
Y1 = ECS-81.92-12-30Q-EN-TR: Crystal or Oscillator; Manufacturer_Name: ECS; Assembly: JLCPCB; Value: 8.192MHz 12pF; Datasheet Link: https://datasheet.datasheetarchive.com/originals/distributors/Datasheets_SAMA/a25c19192314839168edce8dcea0d59f.pdf; Height: 1.1mm; Manufacturer_Part_Number: ECS-81.92-12-30Q-EN-TR; Supplier: JLCPCB; Supplier PN: LCSC C2450755

## Sheet 04_MCU.SchDoc: ESP32-S3, USB y programación
size 420 x 297 mm; Address1: Hardware en IoT · 2026; SheetNumber: 4; SheetTotal: 6
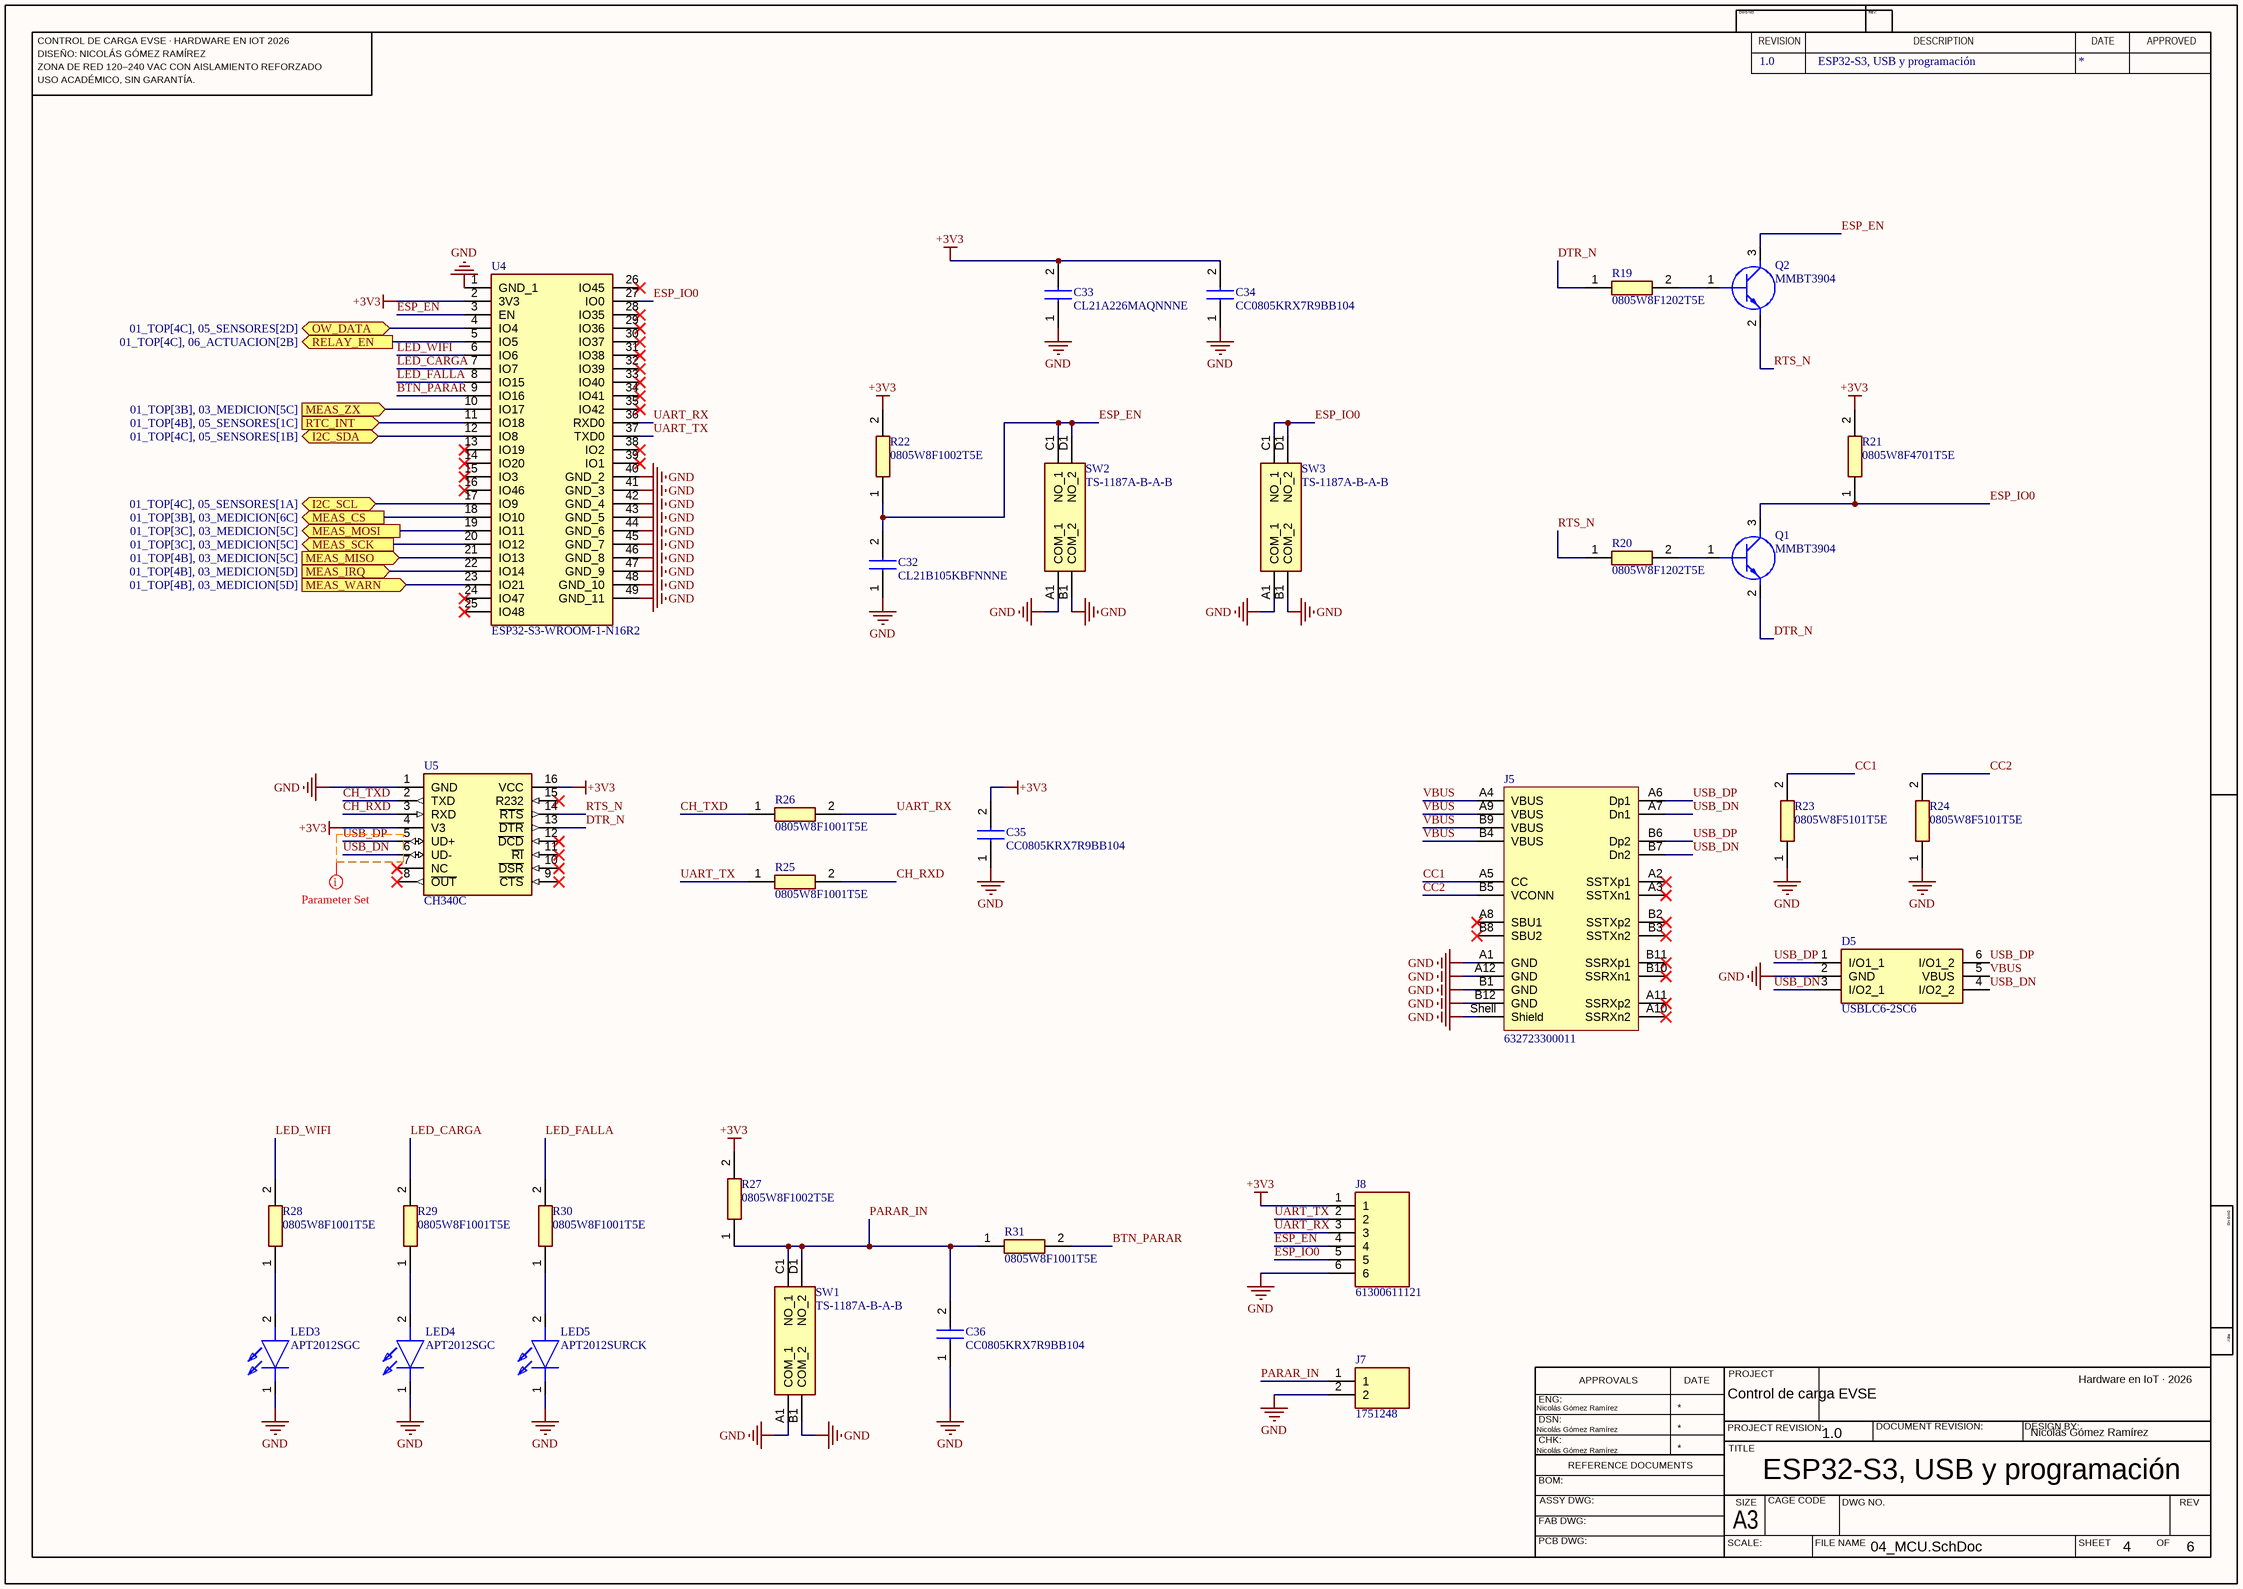
[diagram p3: 04_MCU.SchDoc]

### Parts
C32  CL21B105KBFNNNE  [CAPC2012X88N]
C33  CL21A226MAQNNNE  [CAPC2012X140N]
C34  CC0805KRX7R9BB104  [CAPC2012X88N]
C35  CC0805KRX7R9BB104  [CAPC2012X88N]
C36  CC0805KRX7R9BB104  [CAPC2012X88N]
D5  USBLC6-2SC6  [SOT95P280X145-6N]
J5  632723300011  [632723300011]
J7  1751248  [1751248]
J8  61300611121  [HDRV6W79P0X254_1X6_1524X254X894P]
LED3  APT2012SGC  [LEDC2012X85N]
LED4  APT2012SGC  [LEDC2012X85N]
LED5  APT2012SURCK  [LEDC2012X85N]
Q1  MMBT3904  [SOT96P237X111-3N]
Q2  MMBT3904  [SOT96P237X111-3N]
R19  0805W8F1202T5E  [RESC2012X60N]
R20  0805W8F1202T5E  [RESC2012X60N]
R21  0805W8F4701T5E  [RESC2012X60N]
R22  0805W8F1002T5E  [RESC2012X60N]
R23  0805W8F5101T5E  [RESC2012X60N]
R24  0805W8F5101T5E  [RESC2012X60N]
R25  0805W8F1001T5E  [RESC2012X60N]
R26  0805W8F1001T5E  [RESC2012X60N]
R27  0805W8F1002T5E  [RESC2012X60N]
R28  0805W8F1001T5E  [RESC2012X60N]
R29  0805W8F1001T5E  [RESC2012X60N]
R30  0805W8F1001T5E  [RESC2012X60N]
R31  0805W8F1001T5E  [RESC2012X60N]
SW1  TS-1187A-B-A-B  [TS1187ABAB]
SW2  TS-1187A-B-A-B  [TS1187ABAB]
SW3  TS-1187A-B-A-B  [TS1187ABAB]
U4  ESP32-S3-WROOM-1-N16R2  [ESP32S3WROOM1N16R2]
U5  CH340C  [SOIC127P600X175-16N]

### Ports
I2C_SCL (bidir, see 01_TOP[4C], 05_SENSORES[1A]), I2C_SDA (bidir, see 01_TOP[4C], 05_SENSORES[1B]), MEAS_CS (out, see 01_TOP[3B], 03_MEDICION[6C]), MEAS_IRQ (in, see 01_TOP[4B], 03_MEDICION[5D]), MEAS_MISO (in, see 01_TOP[4B], 03_MEDICION[5C]), MEAS_MOSI (out, see 01_TOP[3C], 03_MEDICION[5C]), MEAS_SCK (out, see 01_TOP[3C], 03_MEDICION[5C]), MEAS_WARN (in, see 01_TOP[4B], 03_MEDICION[5D]), MEAS_ZX (in, see 01_TOP[3B], 03_MEDICION[5C]), OW_DATA (bidir, see 01_TOP[4C], 05_SENSORES[2D]), RELAY_EN (out, see 01_TOP[4C], 06_ACTUACION[2B]), RTC_INT (in, see 01_TOP[4B], 05_SENSORES[1C])

### Nets
+3V3: C33.2 C34.2 C35.2 J8.1 R21.2 R22.2 R27.2 U4.2(3V3) U5.4(V3) U5.16(VCC)
GND: C32.1 C33.1 C34.1 C35.1 C36.1 D5.2(GND) J5.A1(GND) J5.A12(GND) J5.B1(GND) J5.B12(GND) J5.Shell(Shield) J7.2 J8.6 LED3.1(K) LED4.1(K) LED5.1(K) R23.1 R24.1 SW1.A1(COM_1) SW1.B1(COM_2) SW2.A1(COM_1) SW2.B1(COM_2) SW3.A1(COM_1) SW3.B1(COM_2) U4.1(GND_1) U4.40(GND_2) U4.41(GND_3) U4.42(GND_4) U4.43(GND_5) U4.44(GND_6) U4.45(GND_7) U4.46(GND_8) U4.47(GND_9) U4.48(GND_10) U4.49(GND_11) U5.1(GND)
BTN_PARAR: R31.2 U4.9(IO16)
CC1: J5.A5(CC) R23.2
CC2: J5.B5(VCONN) R24.2
CH_RXD: R25.2 U5.3(RXD)
CH_TXD: R26.1 U5.2(TXD)
DTR_N: Q1.2(E) R19.1 U5.13(~{DTR})
ESP_EN: C32.2 J8.4 Q2.3(C) R22.1 SW2.C1(NO_1) SW2.D1(NO_2) U4.3(EN)
ESP_IO0: J8.5 Q1.3(C) R21.1 SW3.C1(NO_1) SW3.D1(NO_2) U4.27(IO0)
I2C_SCL: U4.17(IO9) ; port I2C_SCL
I2C_SDA: U4.12(IO8) ; port I2C_SDA
LED_CARGA: R29.2 U4.7(IO7)
LED_FALLA: R30.2 U4.8(IO15)
LED_WIFI: R28.2 U4.6(IO6)
MEAS_CS: U4.18(IO10) ; port MEAS_CS
MEAS_IRQ: U4.22(IO14) ; port MEAS_IRQ
MEAS_MISO: U4.21(IO13) ; port MEAS_MISO
MEAS_MOSI: U4.19(IO11) ; port MEAS_MOSI
MEAS_SCK: U4.20(IO12) ; port MEAS_SCK
MEAS_WARN: U4.23(IO21) ; port MEAS_WARN
MEAS_ZX: U4.10(IO17) ; port MEAS_ZX
OW_DATA: U4.4(IO4) ; port OW_DATA
PARAR_IN: C36.2 J7.1 R27.1 R31.1 SW1.C1(NO_1) SW1.D1(NO_2)
RELAY_EN: U4.5(IO5) ; port RELAY_EN
RTC_INT: U4.11(IO18) ; port RTC_INT
RTS_N: Q2.2(E) R20.1 U5.14(~{RTS})
UART_RX: J8.3 R26.2 U4.36(RXD0)
UART_TX: J8.2 R25.1 U4.37(TXD0)
USB_DN: D5.3(I/O2_1) D5.4(I/O2_2) J5.A7(Dn1) J5.B7(Dn2) U5.6(UD-)
USB_DP: D5.1(I/O1_1) D5.6(I/O1_2) J5.A6(Dp1) J5.B6(Dp2) U5.5(UD+)
VBUS: D5.5(VBUS) J5.A4(VBUS) J5.A9(VBUS) J5.B4(VBUS) J5.B9(VBUS)
NetLED3_2: LED3.2(A) R28.1
NetLED4_2: LED4.2(A) R29.1
NetLED5_2: LED5.2(A) R30.1
NetQ1_1: Q1.1(B) R20.2
NetQ2_1: Q2.1(B) R19.2

Not connected (* = marked no-connect by the designer): J5 A2(SSTXp1)* A3(SSTXn1)* A8(SBU1)* A10(SSRXn2)* A11(SSRXp2)* B2(SSTXp2)* B3(SSTXn2)* B8(SBU2)* B10(SSRXn1)* B11(SSRXp1)*; U4 13(IO19)* 14(IO20)* 15(IO3)* 16(IO46)* 24(IO47)* 25(IO48)* 26(IO45)* 28(IO35)* 29(IO36)* 30(IO37)* 31(IO38)* 32(IO39)* 33(IO40)* 34(IO41)* 35(IO42)* 38(IO2)* 39(IO1)*; U5 7(NC)* 8(~{OUT})* 9(~{CTS})* 10(~{DSR})* 11(~{RI})* 12(~{DCD})* 15(R232)*

### Layout directives
net class USB: USB_DN, USB_DP

### Notes on the sheet
- CONTROL DE CARGA EVSE · HARDWARE EN IOT 2026
- DISEÑO: NICOLÁS GÓMEZ RAMÍREZ
- DWG NO:
- REVISION
- REV:
- DESCRIPTION
- DATE
- APPROVED
- ZONA DE RED 120–240 VAC CON AISLAMIENTO REFORZADO
- USO ACADÉMICO, SIN GARANTÍA.
- ENG:
- APPROVALS
- PROJECT
- DSN:
- CHK:
- REFERENCE DOCUMENTS
- PROJECT REVISION:
- TITLE
- DOCUMENT REVISION:
- DESIGN BY:
- BOM:
- FAB DWG:
- PCB DWG:
- ASSY DWG:
- SCALE:
- A3
- SIZE
- CAGE CODE
- FILE NAME
- DWG NO.
- SHEET
- OF
- REV

### Library data of the parts
C32 = CL21B105KBFNNNE: as C10 on sheet 03_MEDICION; Manufacturer_Part_Number: CL21B105KBFNNNE; Supplier: JLCPCB; Supplier PN: LCSC C28323; Value: 1uF 50V X7R
C33 = CL21A226MAQNNNE: as C4 on sheet 02_ALIMENTACION; Datasheet Link: https://datasheet.datasheetarchive.com/originals/distributors/Datasheets-DGA10/2406310.pdf; Height: 1.4mm; Manufacturer_Part_Number: CL21A226MAQNNNE; Supplier: JLCPCB; Supplier PN: LCSC C45783
C34-C36 = CC0805KRX7R9BB104: as C12 on sheet 03_MEDICION; Manufacturer_Part_Number: CC0805KRX7R9BB104; Supplier: JLCPCB; Supplier PN: LCSC C49678; Value: 100nF 50V X7R
D5 = USBLC6-2SC6: Integrated Circuit; Manufacturer_Name: STMicroelectronics; Value: ESD USB; Assembly: JLCPCB; Supplier: JLCPCB; Supplier PN: LCSC C7519; Datasheet Link: https://www.st.com/resource/en/datasheet/usblc6-2.pdf; Height: 1.45mm; Manufacturer_Part_Number: USBLC6-2SC6
J5 = CMP-1502-03214-4: Conn USB 3.1 Type C RCP 24 POS 0.5mm/0.4mm Solder RA SMD/Thru-Hole 24 Terminal 1 Port T/R; Manufacturer_Name: Wurth Elektronik; Gender: Receptacle; Pin Length: 1.9mm; Insulation Resistance: 1GΩ; Current Rating: 5A; USB Standard: USB 3.1; Contact Resistance: 30mΩ; Voltage Rating: 20V; Number of Contacts: 24; Value: USB-C 16P USB2.0; Assembly: JLCPCB; Orientation: Horizontal; Mount: Surface Mount, Through Hole; Connector Type: USB; Number of Pins: 24; Height: 3.21mm; Max Operating Temperature: 105°C; Contact Material: Gold, Nickel; RoHS: Compliant; Min Operating Temperature: -40°C; Packaging: Tape and Reel; Manufacturer_Part_Number: 632723300011; Supplier: JLCPCB; Supplier PN: LCSC C2830802
J7 = 1751248: as J6 on sheet 02_ALIMENTACION; Datasheet Link: https://www.phoenixcontact.com/en-us/products/printed-circuit-board-terminal-mkds-1-2-35-1751248?type=pdf; Height: 8.65mm; Manufacturer_Part_Number: 1751248; Supplier: JLCPCB; Supplier PN: LCSC C89122
J8 = 61300611121: Connector; Manufacturer_Name: Wurth Elektronik; Value: 1x6 2.54mm; Assembly: JLCPCB; Datasheet Link: https://www.we-online.com/components/products/datasheet/61300611121.pdf; Height: 8.94mm; Manufacturer_Part_Number: 61300611121; Supplier: JLCPCB; Supplier PN: LCSC C5444523
LED3 LED4 = APT2012SGC: as LED1 on sheet 02_ALIMENTACION; Datasheet Link: http://www.us.kingbright.com/images/catalog/SPEC/APT2012SGC.pdf; Height: 0.85mm; Manufacturer_Part_Number: APT2012SGC; Supplier: JLCPCB; Supplier PN: LCSC C5353439
LED5 = APT2012SURCK: LED; Manufacturer_Name: Kingbright; Assembly: JLCPCB; Value: rojo; Manufacturer_Part_Number: APT2012SURCK; Supplier: JLCPCB; Supplier PN: LCSC C5875730
Q1 Q2 = MMBT3904: Transistor BJT NPN 40 V 200 mA, SOT-23; Manufacturer_Name: Jiangsu Changjing Electronics; Value: NPN 40V 0.2A; Assembly: JLCPCB; Manufacturer_Part_Number: MMBT3904; Supplier: JLCPCB; Supplier PN: LCSC C20526
R19 R20 = 0805W8F1202T5E: Resistor 12 kOhm 1% 125 mW 0805; Manufacturer_Name: UNI-ROYAL; Value: 12k; Assembly: JLCPCB; Manufacturer_Part_Number: 0805W8F1202T5E; Supplier: JLCPCB; Supplier PN: LCSC C17444
R21 = 0805W8F4701T5E: Resistor 4.7 kOhm 1% 125 mW 0805; Manufacturer_Name: UNI-ROYAL; Value: 4.7k; Assembly: JLCPCB; Manufacturer_Part_Number: 0805W8F4701T5E; Supplier: JLCPCB; Supplier PN: LCSC C17673
R22 R27 = 0805W8F1002T5E: as R16 on sheet 03_MEDICION; Manufacturer_Part_Number: 0805W8F1002T5E; Supplier: JLCPCB; Supplier PN: LCSC C17414
R23 R24 = 0805W8F5101T5E: Resistor 5.1 kOhm 1% 125 mW 0805; Manufacturer_Name: UNI-ROYAL; Value: 5.1k; Assembly: JLCPCB; Manufacturer_Part_Number: 0805W8F5101T5E; Supplier: JLCPCB; Supplier PN: LCSC C27834
R25 R26 R28-R31 = 0805W8F1001T5E: as R1 on sheet 02_ALIMENTACION; Manufacturer_Part_Number: 0805W8F1001T5E; Supplier: JLCPCB; Supplier PN: LCSC C17513
SW1 = TS-1187A-B-A-B: Tact switch 5.1 x 5.1 x 1.5 mm, 160 gf, 50 mA 12 VDC; Manufacturer_Name: XKB Connectivity; Value: pulsador 5.1mm; Assembly: JLCPCB; Supplier: JLCPCB; Supplier PN: LCSC C318884; Datasheet Link: http://www.helloxkb.com/public/images/pdf/TS-1187A-X-X-X.pdf; Height: 4.05mm; Manufacturer_Part_Number: TS-1187A-B-A-B
SW2 SW3 = TS-1187A-B-A-B: Tact switch 5.1 x 5.1 x 1.5 mm, 160 gf, 50 mA 12 VDC; Manufacturer_Name: XKB Connectivity; Value: pulsador 5.1mm; Assembly: DNP; Supplier: JLCPCB; Supplier PN: LCSC C318884; Datasheet Link: http://www.helloxkb.com/public/images/pdf/TS-1187A-X-X-X.pdf; Height: 4.05mm; Manufacturer_Part_Number: TS-1187A-B-A-B
U4 = ESP32-S3-WROOM-1-N16R2: Integrated Circuit; Manufacturer_Name: Espressif Systems; Value: N16R2 16MB/2MB; Assembly: JLCPCB; Datasheet Link: https://www.espressif.com/sites/default/files/documentation/esp32-s3-wroom-1_wroom-1u_datasheet_en.pdf; Height: 3.25mm; Manufacturer_Part_Number: ESP32-S3-WROOM-1-N16R2; Supplier: JLCPCB; Supplier PN: LCSC C2913205
U5 = CH340C: USB to UART bridge; Manufacturer_Name: WCH; Value: USB-UART; Assembly: JLCPCB; Supplier PN: LCSC C84681; Supplier: JLCPCB; Datasheet Link: https://www.wch-ic.com/downloads/CH340DS1_PDF.html; Height: 1.75mm; Manufacturer_Part_Number: CH340C

## Sheet 05_SENSORES.SchDoc: Sensores, RTC y sonda 1-Wire
size 420 x 297 mm; Address1: Hardware en IoT · 2026; SheetNumber: 5; SheetTotal: 6
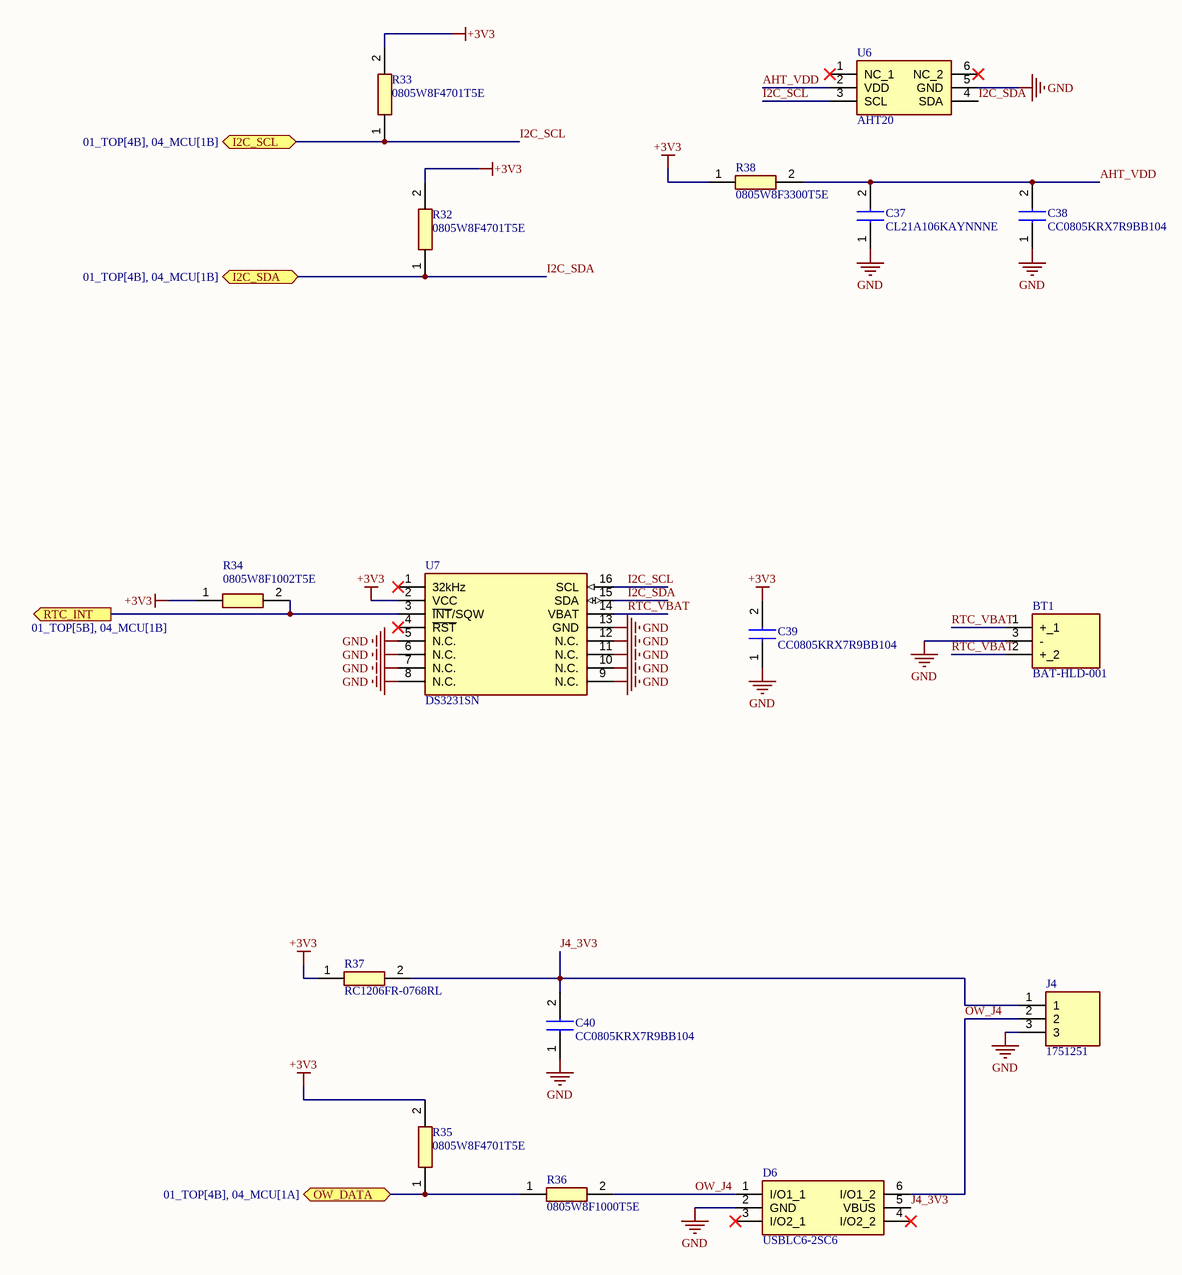
[diagram p4: 05_SENSORES.SchDoc]

### Parts
BT1  BAT-HLD-001  [BATHLD001]
C37  CL21A106KAYNNNE  [CAPC2012X145N]
C38  CC0805KRX7R9BB104  [CAPC2012X88N]
C39  CC0805KRX7R9BB104  [CAPC2012X88N]
C40  CC0805KRX7R9BB104  [CAPC2012X88N]
D6  USBLC6-2SC6  [SOT95P280X145-6N]
J4  1751251  [1751251]
R32  0805W8F4701T5E  [RESC2012X60N]
R33  0805W8F4701T5E  [RESC2012X60N]
R34  0805W8F1002T5E  [RESC2012X60N]
R35  0805W8F4701T5E  [RESC2012X60N]
R36  0805W8F1000T5E  [RESC2012X60N]
R37  RC1206FR-0768RL  [ERJP08_(1206)]
R38  0805W8F3300T5E  [RESC2012X60N]
U6  AHT20  [AHT20]
U7  DS3231SN  [SOIC127P1030X265-16N]

### Ports
I2C_SCL (bidir, see 01_TOP[4B], 04_MCU[1B]), I2C_SDA (bidir, see 01_TOP[4B], 04_MCU[1B]), OW_DATA (bidir, see 01_TOP[4B], 04_MCU[1A]), RTC_INT (out, see 01_TOP[5B], 04_MCU[1B])

### Nets
+3V3: C39.2 R32.2 R33.2 R34.1 R35.2 R37.1 R38.1 U7.2(VCC)
GND: BT1.3(-) C37.1 C38.1 C39.1 C40.1 D6.2(GND) J4.3 U6.5(GND) U7.5(N.C.) U7.6(N.C.) U7.7(N.C.) U7.8(N.C.) U7.9(N.C.) U7.10(N.C.) U7.11(N.C.) U7.12(N.C.) U7.13(GND)
AHT_VDD: C37.2 C38.2 R38.2 U6.2(VDD)
I2C_SCL: R33.1 U6.3(SCL) U7.16(SCL) ; port I2C_SCL
I2C_SDA: R32.1 U6.4(SDA) U7.15(SDA) ; port I2C_SDA
J4_3V3: C40.2 D6.5(VBUS) J4.1 R37.2
OW_DATA: R35.1 R36.1 ; port OW_DATA
OW_J4: D6.1(I/O1_1) D6.6(I/O1_2) J4.2 R36.2
RTC_INT: R34.2 U7.3(~{INT}/SQW) ; port RTC_INT
RTC_VBAT: BT1.1(+_1) BT1.2(+_2) U7.14(VBAT)

Not connected (* = marked no-connect by the designer): D6 3(I/O2_1)* 4(I/O2_2)*; U6 1(NC_1)* 6(NC_2)*; U7 1(32kHz)* 4(~{RST})*

### Notes on the sheet
- CONTROL DE CARGA EVSE · HARDWARE EN IOT 2026
- DISEÑO: NICOLÁS GÓMEZ RAMÍREZ
- DWG NO:
- REVISION
- REV:
- DESCRIPTION
- DATE
- APPROVED
- ZONA DE RED 120–240 VAC CON AISLAMIENTO REFORZADO
- USO ACADÉMICO, SIN GARANTÍA.
- ENG:
- APPROVALS
- PROJECT
- DSN:
- CHK:
- REFERENCE DOCUMENTS
- PROJECT REVISION:
- TITLE
- DOCUMENT REVISION:
- DESIGN BY:
- BOM:
- FAB DWG:
- PCB DWG:
- ASSY DWG:
- SCALE:
- A3
- SIZE
- CAGE CODE
- FILE NAME
- DWG NO.
- SHEET
- OF
- REV

### Library data of the parts
BT1 = BAT-HLD-001: Battery holder CR2032, SMD; Manufacturer_Name: TE Connectivity; Assembly: JLCPCB; Value: CR2032; Supplier: JLCPCB; Supplier PN: LCSC C7501066; Datasheet Link: https://www.te.com/commerce/DocumentDelivery/DDEController?Action=showdoc&DocId=Customer+Drawing%7FC-BAT-HLD-001-xx%7FE%7Fpdf%7FEnglish%7FENG_CD_C-BAT-HLD-001-xx_E.pdf%7FBAT-HLD-001; Height: 4.3mm; Manufacturer_Part_Number: BAT-HLD-001
C37 = CL21A106KAYNNNE: as C7 on sheet 02_ALIMENTACION; Datasheet Link: https://datasheet.datasheetarchive.com/originals/distributors/Datasheets_SAMA/6a45835c9b7400e9b49c55c38a8ff4a2.pdf; Height: 1.45mm; Manufacturer_Part_Number: CL21A106KAYNNNE; Supplier: JLCPCB; Supplier PN: LCSC C15850
C38-C40 = CC0805KRX7R9BB104: as C12 on sheet 03_MEDICION; Manufacturer_Part_Number: CC0805KRX7R9BB104; Supplier: JLCPCB; Supplier PN: LCSC C49678; Value: 100nF 50V X7R
D6 = USBLC6-2SC6: as D5 on sheet 04_MCU; Supplier: JLCPCB; Supplier PN: LCSC C7519; Datasheet Link: https://www.st.com/resource/en/datasheet/usblc6-2.pdf; Height: 1.45mm; Manufacturer_Part_Number: USBLC6-2SC6
J4 = 1751251: Connector; Manufacturer_Name: Phoenix Contact; Value: 3P 3.5mm; Assembly: JLCPCB; Datasheet Link: https://www.phoenixcontact.com/en-us/products/printed-circuit-board-terminal-mkds-1-3-35-1751251?type=pdf; Height: 8.65mm; Manufacturer_Part_Number: 1751251; Supplier: JLCPCB; Supplier PN: LCSC C91152
R32 R33 R35 = 0805W8F4701T5E: as R21 on sheet 04_MCU; Manufacturer_Part_Number: 0805W8F4701T5E; Supplier: JLCPCB; Supplier PN: LCSC C17673
R34 = 0805W8F1002T5E: as R16 on sheet 03_MEDICION; Manufacturer_Part_Number: 0805W8F1002T5E; Supplier: JLCPCB; Supplier PN: LCSC C17414
R36 = 0805W8F1000T5E: Resistor 100 Ohm 1% 125 mW 0805; Manufacturer_Name: UNI-ROYAL; Value: 100R; Assembly: JLCPCB; Manufacturer_Part_Number: 0805W8F1000T5E; Supplier: JLCPCB; Supplier PN: LCSC C17408
R37 = RC1206FR-0768RL: Resistor; Manufacturer_Name: Yageo; Assembly: JLCPCB; Value: 68R 1206; Manufacturer_Part_Number: RC1206FR-0768RL; Supplier: JLCPCB; Supplier PN: LCSC C137238
R38 = 0805W8F3300T5E: Resistor 330 Ohm 1% 125 mW 0805; Manufacturer_Name: UNI-ROYAL; Value: 330R; Assembly: JLCPCB; Manufacturer_Part_Number: 0805W8F3300T5E; Supplier: JLCPCB; Supplier PN: LCSC C17630
U6 = AHT20: Integrated Circuit; Manufacturer_Name: Aosong; Value: T/HR I2C 0x38; Assembly: JLCPCB; Datasheet Link: https://www.lcsc.com/datasheet/C2757850.pdf; Height: 1.1mm; Manufacturer_Part_Number: AHT20; Supplier: JLCPCB; Supplier PN: LCSC C2757850
U7 = DS3231SN: I2C RTC with integrated TCXO and crystal, VBAT, SO-16W; Manufacturer_Name: Analog Devices; Manufacturer_Part_Number: DS3231SN#T&R; Assembly: JLCPCB; Value: RTC TCXO 2ppm; Datasheet Link: https://www.analog.com/media/en/technical-documentation/data-sheets/DS3231.pdf; Height: 2.65mm; Supplier: JLCPCB; Supplier PN: LCSC C9866

## Sheet 06_ACTUACION.SchDoc: Actuación: PhotoMOS K1 al EVSE
size 420 x 297 mm; Address1: Hardware en IoT · 2026; SheetNumber: 6; SheetTotal: 6
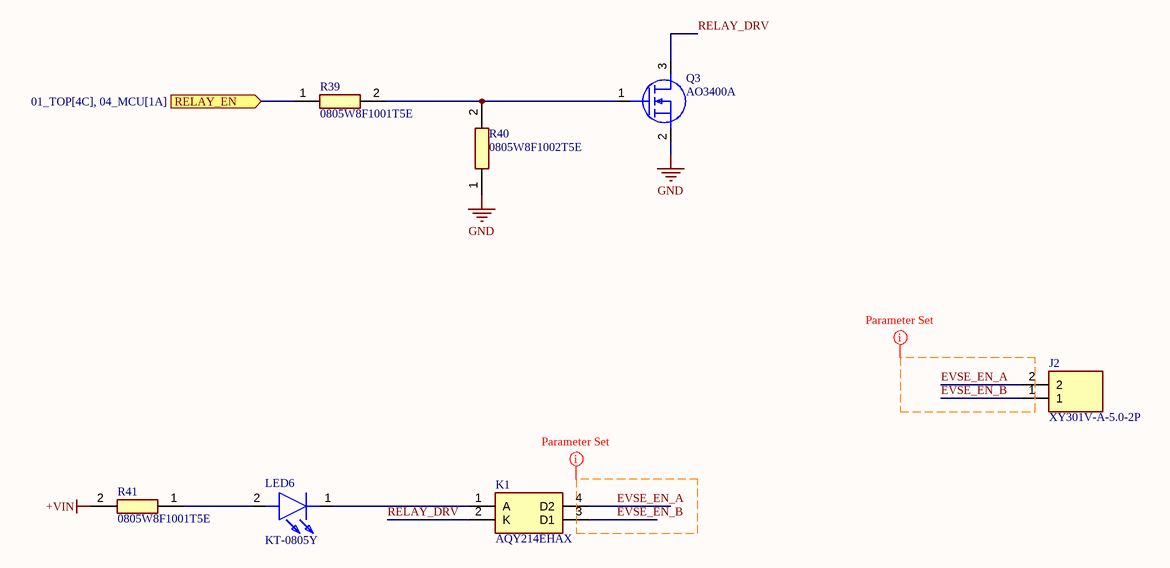
[diagram p5: 06_ACTUACION.SchDoc]

### Parts
J2  XY301V-A-5.0-2P  [TB001-500-02BE]
K1  AQY214EHAX  [SOP254P962X315-4N]
LED6  KT-0805Y  [LEDC2012X85N]
Q3  AO3400A  [SOT96P237X111-3N]
R39  0805W8F1001T5E  [RESC2012X60N]
R40  0805W8F1002T5E  [RESC2012X60N]
R41  0805W8F1001T5E  [RESC2012X60N]

### Ports
RELAY_EN (in, see 01_TOP[4C], 04_MCU[1A])

### Nets
+VIN: R41.2
GND: Q3.2(S) R40.1
EVSE_EN_A: J2.2 K1.4(D2)
EVSE_EN_B: J2.1 K1.3(D1)
RELAY_DRV: K1.2(K) Q3.3(D)
RELAY_EN: R39.1 ; port RELAY_EN
NetK1_1: K1.1(A) LED6.1(K)
NetLED6_2: LED6.2(A) R41.1
NetQ3_1: Q3.1(G) R39.2 R40.2

### Layout directives
net class EVSE_EXT: EVSE_EN_A, EVSE_EN_B

### Notes on the sheet
- CONTROL DE CARGA EVSE · HARDWARE EN IOT 2026
- DISEÑO: NICOLÁS GÓMEZ RAMÍREZ
- DWG NO:
- REVISION
- REV:
- DESCRIPTION
- DATE
- APPROVED
- ZONA DE RED 120–240 VAC CON AISLAMIENTO REFORZADO
- USO ACADÉMICO, SIN GARANTÍA.
- ENG:
- APPROVALS
- PROJECT
- DSN:
- CHK:
- REFERENCE DOCUMENTS
- PROJECT REVISION:
- TITLE
- DOCUMENT REVISION:
- DESIGN BY:
- BOM:
- FAB DWG:
- PCB DWG:
- ASSY DWG:
- SCALE:
- A3
- SIZE
- CAGE CODE
- FILE NAME
- DWG NO.
- SHEET
- OF
- REV

### Library data of the parts
J2 = XY301V-A-5.0-2P: as J1 on sheet 02_ALIMENTACION; Manufacturer_Part_Number: XY301V-A-5.0-2P; Supplier: JLCPCB; Supplier PN: LCSC C557651
K1 = AQY214EHAX: PhotoMOS 1 Form A (NO), 400 V 120 mA, reinforced insulation 5000 Vrms, SMD DIP-4; Manufacturer_Name: Panasonic; Value: PhotoMOS NA; Assembly: JLCPCB; Manufacturer_Part_Number: AQY214EHAX; Supplier: JLCPCB; Supplier PN: LCSC C371971
LED6 = KT-0805Y: LED yellow 0805, 590 nm; Manufacturer_Name: Hubei KENTO Electronic; Assembly: JLCPCB; Value: amarillo; Manufacturer_Part_Number: KT-0805Y; Supplier: JLCPCB; Supplier PN: LCSC C2296; Datasheet Link: https://www.lcsc.com/datasheet/C2296.pdf
Q3 = AO3400A: MOSFET N-channel 30V 5.7A, Rds(on) 48mR max at Vgs 2.5V, SOT-23; Manufacturer_Name: Alpha & Omega Semiconductor; Value: NMOS 30V 5.7A; Assembly: JLCPCB; Supplier: JLCPCB; Supplier PN: LCSC C20917; Datasheet Link: https://www.aosmd.com/res/datasheets/AO3400A.pdf; Manufacturer_Part_Number: AO3400A
R39 R41 = 0805W8F1001T5E: as R1 on sheet 02_ALIMENTACION; Manufacturer_Part_Number: 0805W8F1001T5E; Supplier: JLCPCB; Supplier PN: LCSC C17513
R40 = 0805W8F1002T5E: as R16 on sheet 03_MEDICION; Manufacturer_Part_Number: 0805W8F1002T5E; Supplier: JLCPCB; Supplier PN: LCSC C17414

## Nets that join several sheets
+3V3: 02_ALIMENTACION (7 pins), 03_MEDICION (11 pins), 04_MCU (10 pins), 05_SENSORES (8 pins)
+3V3A: 02_ALIMENTACION (C8.1 FB1.2 TP4.1), 03_MEDICION (C28.1 U3.5)
+VIN: 02_ALIMENTACION (6 pins), 06_ACTUACION (R41.2)
GND: 02_ALIMENTACION (13 pins), 03_MEDICION (29 pins), 04_MCU (36 pins), 05_SENSORES (17 pins), 06_ACTUACION (Q3.2 R40.1)
AC_L1_F: 02_ALIMENTACION (F1.2 F1B.2 PS1.4 RV1.1), 03_MEDICION (R2.1)
AC_L2_F: 02_ALIMENTACION (F2.2 F2B.2 PS1.1 RV1.2), 03_MEDICION (11 pins)
I2C_SCL: 04_MCU (U4.17), 05_SENSORES (R33.1 U6.3 U7.16)
I2C_SDA: 04_MCU (U4.12), 05_SENSORES (R32.1 U6.4 U7.15)
MEAS_CS: 03_MEDICION (R18.2 U3.24), 04_MCU (U4.18)
MEAS_IRQ: 03_MEDICION (U3.20), 04_MCU (U4.22)
MEAS_MISO: 03_MEDICION (U3.26), 04_MCU (U4.21)
MEAS_MOSI: 03_MEDICION (U3.27), 04_MCU (U4.19)
MEAS_SCK: 03_MEDICION (U3.25), 04_MCU (U4.20)
MEAS_WARN: 03_MEDICION (U3.17), 04_MCU (U4.23)
MEAS_ZX: 03_MEDICION (U3.21), 04_MCU (U4.10)
OW_DATA: 04_MCU (U4.4), 05_SENSORES (R35.1 R36.1)
RELAY_EN: 04_MCU (U4.5), 06_ACTUACION (R39.1)
RTC_INT: 04_MCU (U4.11), 05_SENSORES (R34.2 U7.3)